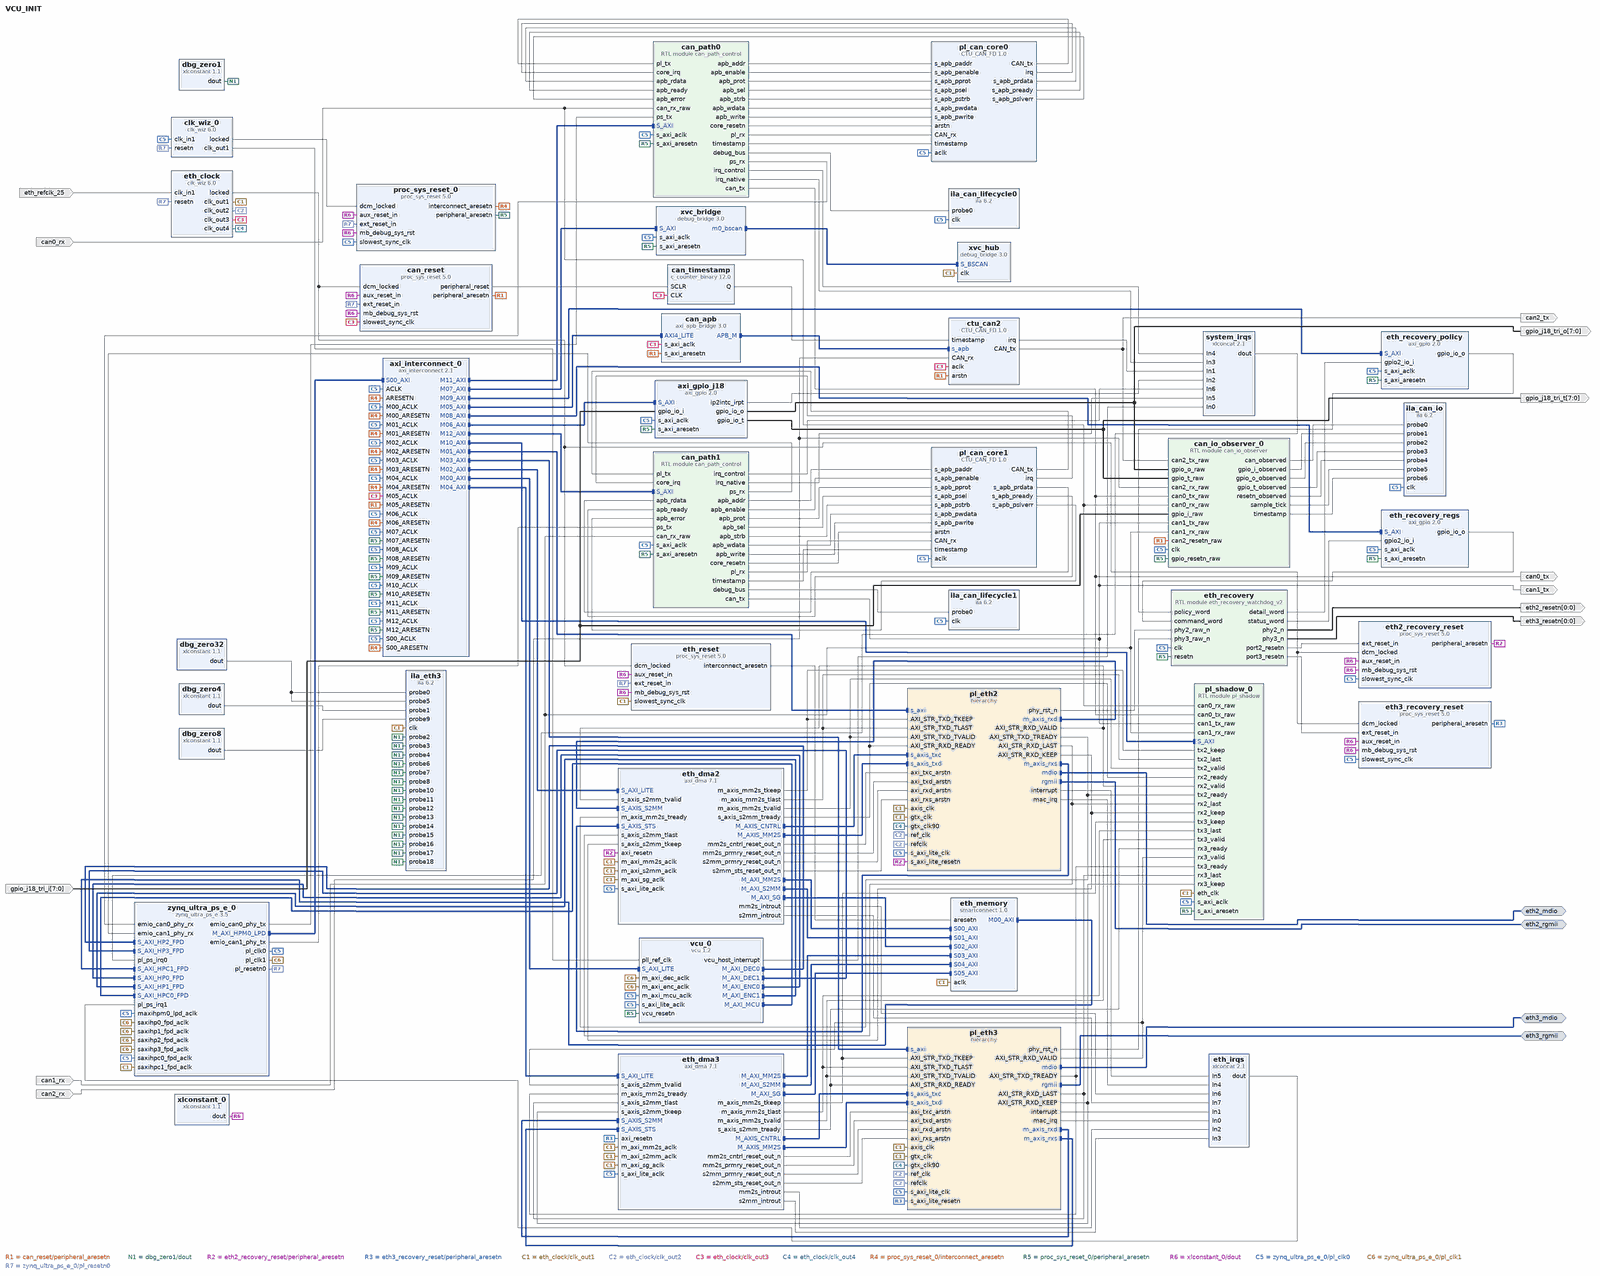
[diagram p0: block diagram of the top level, whole]
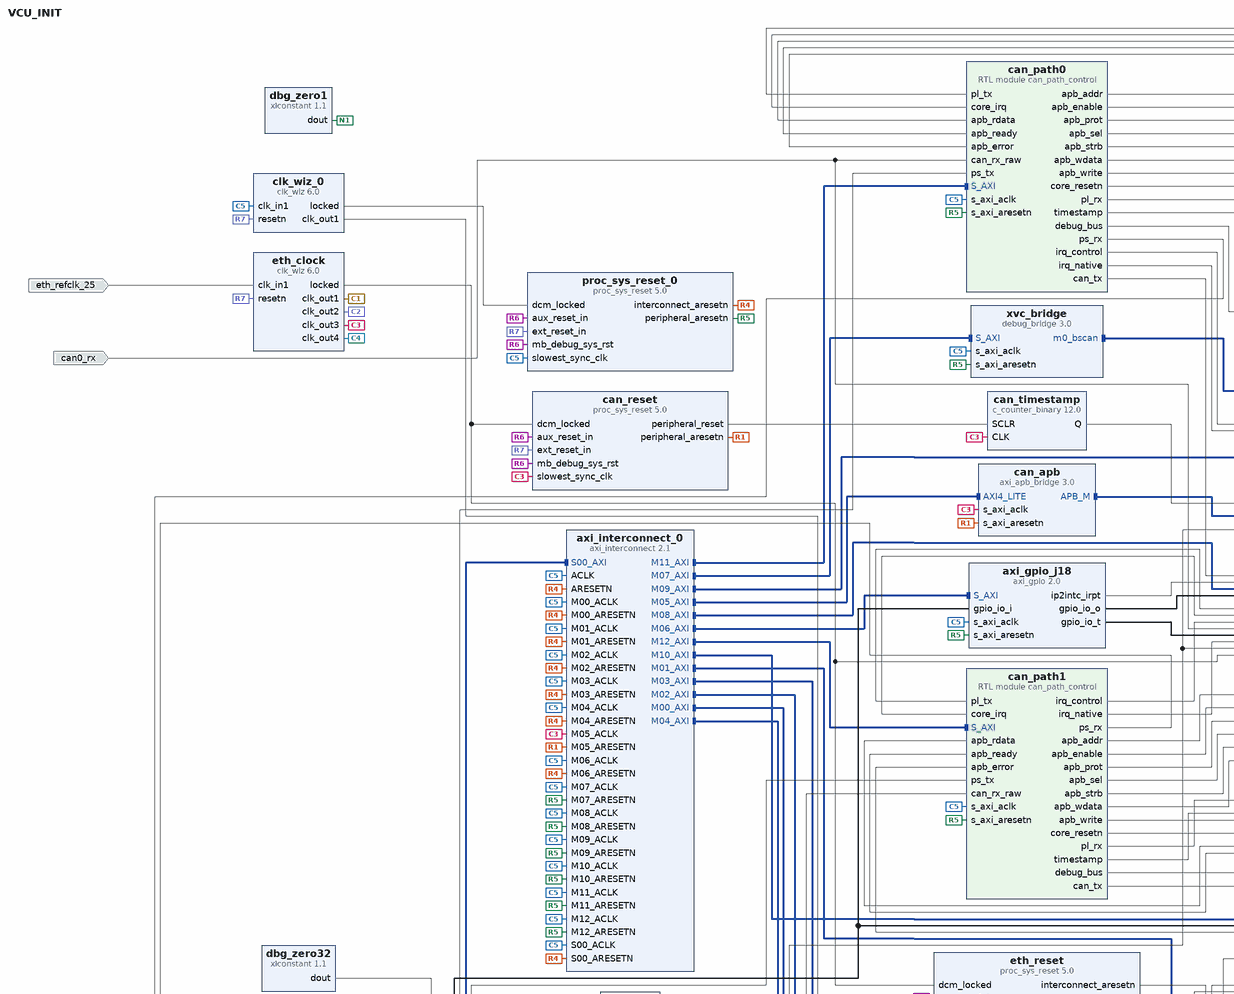
[diagram p1: block diagram of the top level, upper left part]
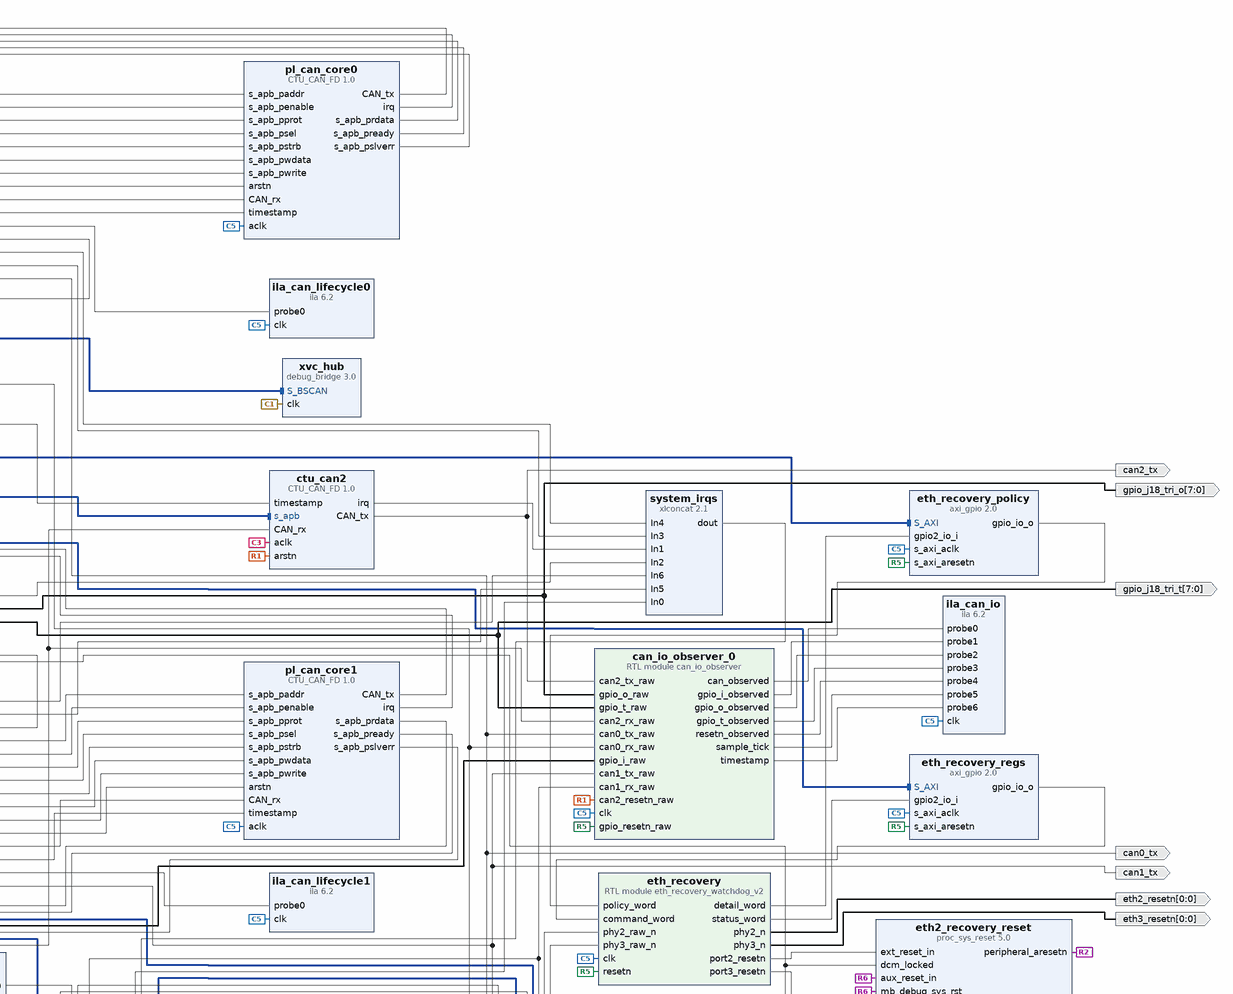
[diagram p2: block diagram of the top level, upper right part]
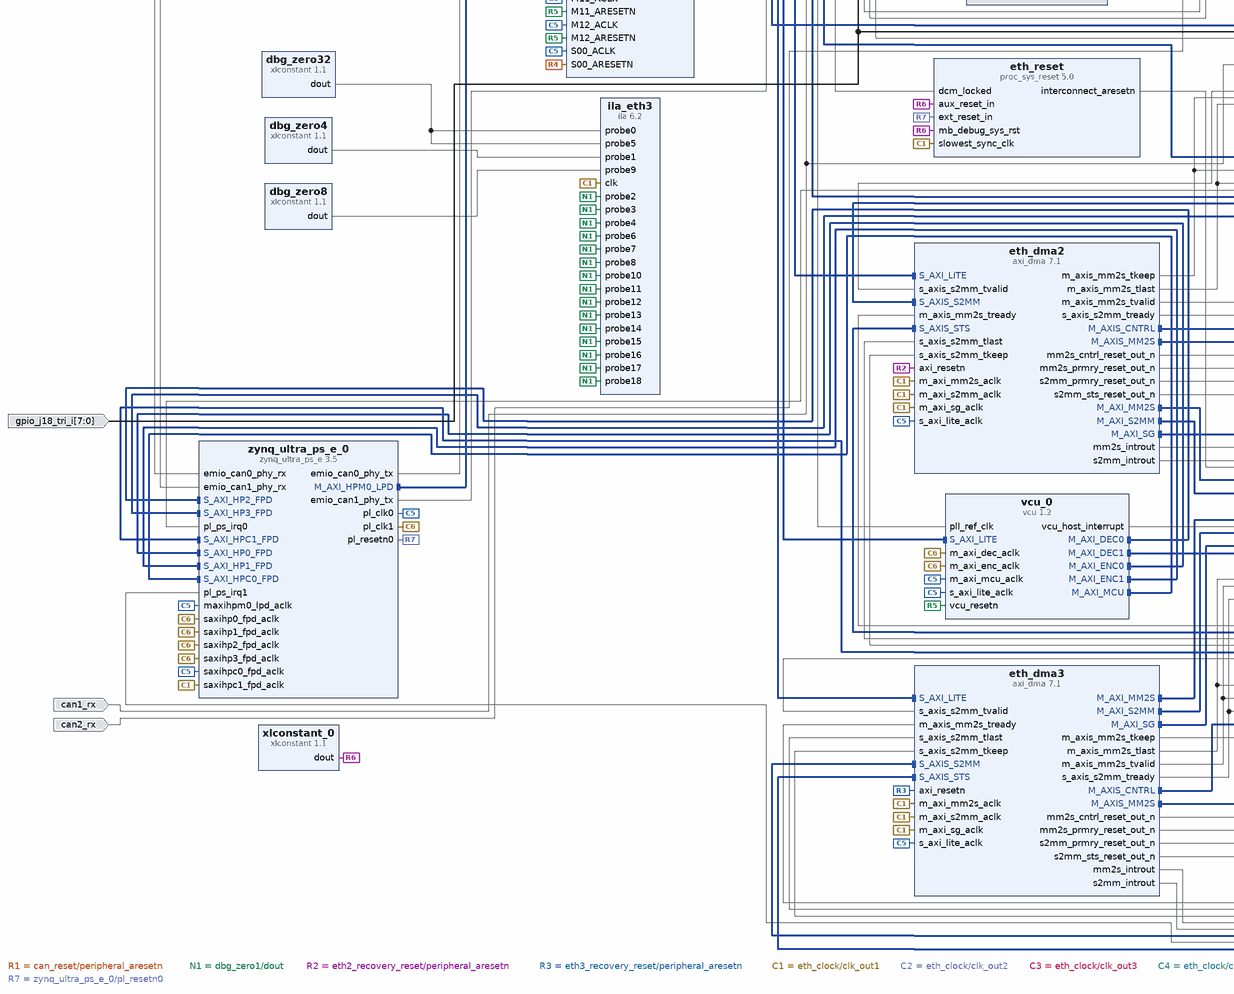
[diagram p3: block diagram of the top level, lower left part]
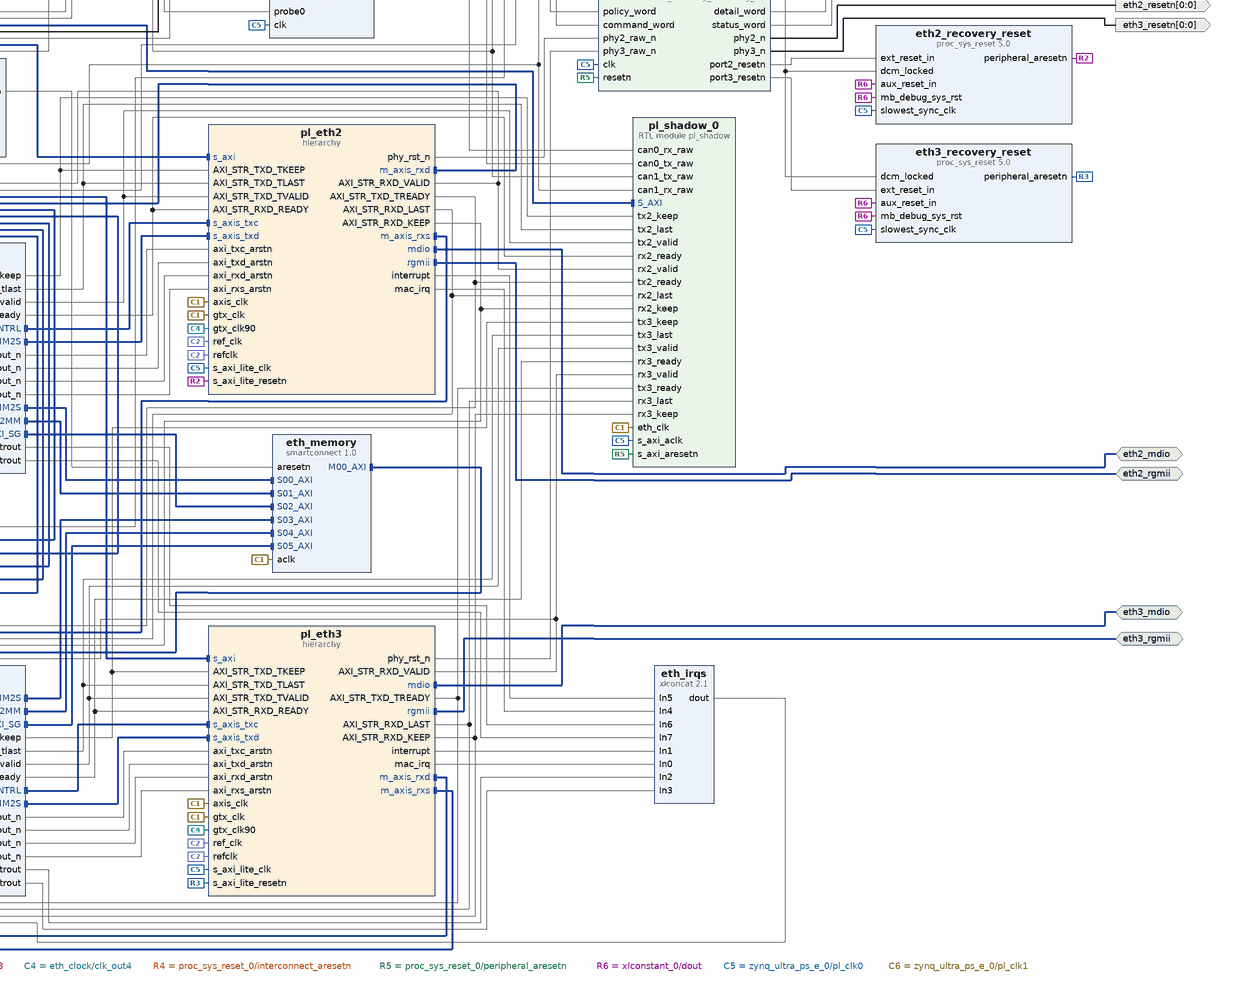
[diagram p4: block diagram of the top level, lower right part]
# Vivado block design VCU_INIT, xck26-sfvc784-2LV-c, Vivado 2026.1
create_bd_design VCU_INIT

create_bd_intf_port -mode Master -vlnv xilinx.com:interface:rgmii_rtl:1.0 eth2_rgmii
create_bd_intf_port -mode Master -vlnv xilinx.com:interface:mdio_rtl:1.0 eth2_mdio
create_bd_intf_port -mode Master -vlnv xilinx.com:interface:rgmii_rtl:1.0 eth3_rgmii
create_bd_intf_port -mode Master -vlnv xilinx.com:interface:mdio_rtl:1.0 eth3_mdio
create_bd_port -dir O -from 0 -to 0 -type rst eth2_resetn
create_bd_port -dir O -from 0 -to 0 -type rst eth3_resetn
create_bd_port -dir I -type clk eth_refclk_25
set_property -dict {CONFIG.FREQ_HZ 25000000} [get_bd_ports eth_refclk_25]
create_bd_port -dir I can0_rx
create_bd_port -dir O can0_tx
create_bd_port -dir I can1_rx
create_bd_port -dir O can1_tx
create_bd_port -dir I can2_rx
create_bd_port -dir O can2_tx
create_bd_port -dir I -from 7 -to 0 gpio_j18_tri_i
create_bd_port -dir O -from 7 -to 0 gpio_j18_tri_o
create_bd_port -dir O -from 7 -to 0 gpio_j18_tri_t

create_bd_cell -type ip -vlnv xilinx.com:ip:zynq_ultra_ps_e:3.5 zynq_ultra_ps_e_0
set_property -dict [list \
  CONFIG.PSU_BANK_0_IO_STANDARD LVCMOS18 \
  CONFIG.PSU_BANK_1_IO_STANDARD LVCMOS18 \
  CONFIG.PSU_BANK_2_IO_STANDARD LVCMOS18 \
  CONFIG.PSU_BANK_3_IO_STANDARD LVCMOS18 \
  CONFIG.PSU__CAN0__PERIPHERAL__ENABLE 1 \
  CONFIG.PSU__CAN0__PERIPHERAL__IO EMIO \
  CONFIG.PSU__CAN1__PERIPHERAL__ENABLE 1 \
  CONFIG.PSU__CAN1__PERIPHERAL__IO EMIO \
  CONFIG.PSU__CRF_APB__ACPU_CTRL__FREQMHZ 1333.333 \
  CONFIG.PSU__CRF_APB__ACPU_CTRL__SRCSEL APLL \
  CONFIG.PSU__CRF_APB__APLL_CTRL__SRCSEL PSS_REF_CLK \
  CONFIG.PSU__CRF_APB__APLL_FRAC_CFG__ENABLED 1 \
  CONFIG.PSU__CRF_APB__DBG_FPD_CTRL__FREQMHZ 250 \
  CONFIG.PSU__CRF_APB__DBG_FPD_CTRL__SRCSEL IOPLL \
  CONFIG.PSU__CRF_APB__DBG_TRACE_CTRL__FREQMHZ 250 \
  CONFIG.PSU__CRF_APB__DBG_TRACE_CTRL__SRCSEL IOPLL \
  CONFIG.PSU__CRF_APB__DBG_TSTMP_CTRL__FREQMHZ 250 \
  CONFIG.PSU__CRF_APB__DBG_TSTMP_CTRL__SRCSEL IOPLL \
  CONFIG.PSU__CRF_APB__DDR_CTRL__FREQMHZ 1200 \
  CONFIG.PSU__CRF_APB__DDR_CTRL__SRCSEL DPLL \
  CONFIG.PSU__CRF_APB__DPDMA_REF_CTRL__FREQMHZ 600 \
  CONFIG.PSU__CRF_APB__DPDMA_REF_CTRL__SRCSEL APLL \
  CONFIG.PSU__CRF_APB__DPLL_CTRL__SRCSEL PSS_REF_CLK \
  CONFIG.PSU__CRF_APB__DP_AUDIO_REF_CTRL__SRCSEL RPLL \
  CONFIG.PSU__CRF_APB__DP_STC_REF_CTRL__SRCSEL RPLL \
  CONFIG.PSU__CRF_APB__DP_VIDEO_REF_CTRL__SRCSEL VPLL \
  CONFIG.PSU__CRF_APB__GDMA_REF_CTRL__FREQMHZ 600 \
  CONFIG.PSU__CRF_APB__GDMA_REF_CTRL__SRCSEL DPLL \
  CONFIG.PSU__CRF_APB__GPU_REF_CTRL__FREQMHZ 600 \
  CONFIG.PSU__CRF_APB__GPU_REF_CTRL__SRCSEL IOPLL \
  CONFIG.PSU__CRF_APB__TOPSW_LSBUS_CTRL__FREQMHZ 100 \
  CONFIG.PSU__CRF_APB__TOPSW_LSBUS_CTRL__SRCSEL IOPLL \
  CONFIG.PSU__CRF_APB__TOPSW_MAIN_CTRL__FREQMHZ 533.33 \
  CONFIG.PSU__CRF_APB__TOPSW_MAIN_CTRL__SRCSEL DPLL \
  CONFIG.PSU__CRF_APB__VPLL_CTRL__SRCSEL PSS_REF_CLK \
  CONFIG.PSU__CRL_APB__ADMA_REF_CTRL__FREQMHZ 500 \
  CONFIG.PSU__CRL_APB__ADMA_REF_CTRL__SRCSEL IOPLL \
  CONFIG.PSU__CRL_APB__CAN1_REF_CTRL__FREQMHZ 100 \
  CONFIG.PSU__CRL_APB__CPU_R5_CTRL__FREQMHZ 533.333 \
  CONFIG.PSU__CRL_APB__CPU_R5_CTRL__SRCSEL RPLL \
  CONFIG.PSU__CRL_APB__DBG_LPD_CTRL__FREQMHZ 250 \
  CONFIG.PSU__CRL_APB__DBG_LPD_CTRL__SRCSEL IOPLL \
  CONFIG.PSU__CRL_APB__IOPLL_CTRL__SRCSEL PSS_REF_CLK \
  CONFIG.PSU__CRL_APB__IOU_SWITCH_CTRL__FREQMHZ 250 \
  CONFIG.PSU__CRL_APB__IOU_SWITCH_CTRL__SRCSEL IOPLL \
  CONFIG.PSU__CRL_APB__LPD_LSBUS_CTRL__FREQMHZ 100 \
  CONFIG.PSU__CRL_APB__LPD_LSBUS_CTRL__SRCSEL IOPLL \
  CONFIG.PSU__CRL_APB__LPD_SWITCH_CTRL__FREQMHZ 500 \
  CONFIG.PSU__CRL_APB__LPD_SWITCH_CTRL__SRCSEL IOPLL \
  CONFIG.PSU__CRL_APB__PCAP_CTRL__FREQMHZ 200 \
  CONFIG.PSU__CRL_APB__PCAP_CTRL__SRCSEL IOPLL \
  CONFIG.PSU__CRL_APB__PL0_REF_CTRL__FREQMHZ 100 \
  CONFIG.PSU__CRL_APB__PL0_REF_CTRL__SRCSEL IOPLL \
  CONFIG.PSU__CRL_APB__PL1_REF_CTRL__FREQMHZ 250 \
  CONFIG.PSU__CRL_APB__PL1_REF_CTRL__SRCSEL IOPLL \
  CONFIG.PSU__CRL_APB__QSPI_REF_CTRL__FREQMHZ 125 \
  CONFIG.PSU__CRL_APB__QSPI_REF_CTRL__SRCSEL IOPLL \
  CONFIG.PSU__CRL_APB__RPLL_CTRL__SRCSEL PSS_REF_CLK \
  CONFIG.PSU__CRL_APB__SPI1_REF_CTRL__SRCSEL IOPLL \
  CONFIG.PSU__CRL_APB__TIMESTAMP_REF_CTRL__FREQMHZ 100 \
  CONFIG.PSU__CRL_APB__TIMESTAMP_REF_CTRL__SRCSEL IOPLL \
  CONFIG.PSU__CSUPMU__PERIPHERAL__VALID 1 \
  CONFIG.PSU__DDRC__BUS_WIDTH {64 Bit} \
  CONFIG.PSU__DDRC__COMPONENTS Components \
  CONFIG.PSU__DDRC__DEVICE_CAPACITY {8192 MBits} \
  CONFIG.PSU__DDRC__DRAM_WIDTH {16 Bits} \
  CONFIG.PSU__DDRC__ECC Disabled \
  CONFIG.PSU__DDRC__MEMORY_TYPE {DDR 4} \
  CONFIG.PSU__DDRC__SPEED_BIN DDR4_2400R \
  CONFIG.PSU__DDR_HIGH_ADDRESS_GUI_ENABLE 1 \
  CONFIG.PSU__DDR__INTERFACE__FREQMHZ 600.000 \
  CONFIG.PSU__DISPLAYPORT__LANE0__ENABLE 1 \
  CONFIG.PSU__DISPLAYPORT__LANE0__IO {GT Lane1} \
  CONFIG.PSU__DISPLAYPORT__LANE1__ENABLE 0 \
  CONFIG.PSU__DISPLAYPORT__PERIPHERAL__ENABLE 1 \
  CONFIG.PSU__DPAUX__PERIPHERAL__ENABLE 1 \
  CONFIG.PSU__DPAUX__PERIPHERAL__IO {MIO 27 .. 30} \
  CONFIG.PSU__DP__LANE_SEL {Single Lower} \
  CONFIG.PSU__DP__REF_CLK_FREQ 27 \
  CONFIG.PSU__DP__REF_CLK_SEL {Ref Clk1} \
  CONFIG.PSU__FPGA_PL0_ENABLE 1 \
  CONFIG.PSU__FPGA_PL1_ENABLE 1 \
  CONFIG.PSU__GPIO0_MIO__IO {MIO 0 .. 25} \
  CONFIG.PSU__GPIO0_MIO__PERIPHERAL__ENABLE 1 \
  CONFIG.PSU__GPIO1_MIO__IO {MIO 26 .. 51} \
  CONFIG.PSU__GPIO1_MIO__PERIPHERAL__ENABLE 1 \
  CONFIG.PSU__GT__LINK_SPEED HBR \
  CONFIG.PSU__GT__PRE_EMPH_LVL_4 0 \
  CONFIG.PSU__GT__VLT_SWNG_LVL_4 0 \
  CONFIG.PSU__IOU_SLCR__IOU_TTC_APB_CLK__TTC0_SEL APB \
  CONFIG.PSU__IOU_SLCR__IOU_TTC_APB_CLK__TTC1_SEL APB \
  CONFIG.PSU__IOU_SLCR__IOU_TTC_APB_CLK__TTC2_SEL APB \
  CONFIG.PSU__IOU_SLCR__IOU_TTC_APB_CLK__TTC3_SEL APB \
  CONFIG.PSU__OVERRIDE__BASIC_CLOCK 0 \
  CONFIG.PSU__PMU_COHERENCY 0 \
  CONFIG.PSU__PMU__AIBACK__ENABLE 0 \
  CONFIG.PSU__PMU__EMIO_GPI__ENABLE 0 \
  CONFIG.PSU__PMU__EMIO_GPO__ENABLE 0 \
  CONFIG.PSU__PMU__GPI0__ENABLE 1 \
  CONFIG.PSU__PMU__GPI0__IO {MIO 26} \
  CONFIG.PSU__PMU__GPI1__ENABLE 0 \
  CONFIG.PSU__PMU__GPI2__ENABLE 0 \
  CONFIG.PSU__PMU__GPI3__ENABLE 0 \
  CONFIG.PSU__PMU__GPI4__ENABLE 0 \
  CONFIG.PSU__PMU__GPI5__ENABLE 1 \
  CONFIG.PSU__PMU__GPI5__IO {MIO 31} \
  CONFIG.PSU__PMU__GPO0__ENABLE 0 \
  CONFIG.PSU__PMU__GPO1__ENABLE 0 \
  CONFIG.PSU__PMU__GPO2__ENABLE 0 \
  CONFIG.PSU__PMU__GPO3__ENABLE 1 \
  CONFIG.PSU__PMU__GPO3__IO {MIO 35} \
  CONFIG.PSU__PMU__GPO3__POLARITY low \
  CONFIG.PSU__PMU__GPO4__ENABLE 0 \
  CONFIG.PSU__PMU__GPO5__ENABLE 0 \
  CONFIG.PSU__PMU__PERIPHERAL__ENABLE 1 \
  CONFIG.PSU__PMU__PLERROR__ENABLE 0 \
  CONFIG.PSU__PRESET_APPLIED 1 \
  CONFIG.PSU__PSS_REF_CLK__FREQMHZ 33.333 \
  CONFIG.PSU__QSPI_COHERENCY 0 \
  CONFIG.PSU__QSPI_ROUTE_THROUGH_FPD 0 \
  CONFIG.PSU__QSPI__GRP_FBCLK__ENABLE 0 \
  CONFIG.PSU__QSPI__PERIPHERAL__DATA_MODE x4 \
  CONFIG.PSU__QSPI__PERIPHERAL__ENABLE 1 \
  CONFIG.PSU__QSPI__PERIPHERAL__IO {MIO 0 .. 5} \
  CONFIG.PSU__QSPI__PERIPHERAL__MODE Single \
  CONFIG.PSU__SAXIGP0__DATA_WIDTH 32 \
  CONFIG.PSU__SPI1__GRP_SS0__IO {MIO 9} \
  CONFIG.PSU__SPI1__PERIPHERAL__ENABLE 1 \
  CONFIG.PSU__SPI1__PERIPHERAL__IO {MIO 6 .. 11} \
  CONFIG.PSU__SWDT0__CLOCK__ENABLE 0 \
  CONFIG.PSU__SWDT0__PERIPHERAL__ENABLE 1 \
  CONFIG.PSU__SWDT0__RESET__ENABLE 0 \
  CONFIG.PSU__SWDT1__CLOCK__ENABLE 0 \
  CONFIG.PSU__SWDT1__PERIPHERAL__ENABLE 1 \
  CONFIG.PSU__SWDT1__RESET__ENABLE 0 \
  CONFIG.PSU__TTC0__CLOCK__ENABLE 0 \
  CONFIG.PSU__TTC0__PERIPHERAL__ENABLE 1 \
  CONFIG.PSU__TTC0__WAVEOUT__ENABLE 0 \
  CONFIG.PSU__TTC1__CLOCK__ENABLE 0 \
  CONFIG.PSU__TTC1__PERIPHERAL__ENABLE 1 \
  CONFIG.PSU__TTC1__WAVEOUT__ENABLE 0 \
  CONFIG.PSU__TTC2__CLOCK__ENABLE 0 \
  CONFIG.PSU__TTC2__PERIPHERAL__ENABLE 1 \
  CONFIG.PSU__TTC2__WAVEOUT__ENABLE 0 \
  CONFIG.PSU__TTC3__CLOCK__ENABLE 0 \
  CONFIG.PSU__TTC3__PERIPHERAL__ENABLE 1 \
  CONFIG.PSU__TTC3__WAVEOUT__ENABLE 0 \
  CONFIG.PSU__USE__IRQ0 1 \
  CONFIG.PSU__USE__IRQ1 1 \
  CONFIG.PSU__USE__M_AXI_GP0 0 \
  CONFIG.PSU__USE__M_AXI_GP1 0 \
  CONFIG.PSU__USE__M_AXI_GP2 1 \
  CONFIG.PSU__USE__S_AXI_GP0 1 \
  CONFIG.PSU__USE__S_AXI_GP1 1 \
  CONFIG.PSU__USE__S_AXI_GP2 1 \
  CONFIG.PSU__USE__S_AXI_GP3 1 \
  CONFIG.PSU__USE__S_AXI_GP4 1 \
  CONFIG.PSU__USE__S_AXI_GP5 1 \
] [get_bd_cells zynq_ultra_ps_e_0]
# 268 more settings of zynq_ultra_ps_e_0 are not shown: defaults, MIO pin electricals, DDR timing, and values the tool derives
create_bd_cell -type ip -vlnv xilinx.com:ip:vcu:1.2 vcu_0
set_property -dict [list \
  CONFIG.DEC_CODING_TYPE 1 \
  CONFIG.DEC_COLOR_DEPTH 0 \
  CONFIG.DEC_COLOR_FORMAT 0 \
  CONFIG.DEC_FPS 1 \
  CONFIG.DEC_FRAME_SIZE 3 \
  CONFIG.DEC_VIDEO_STANDARD 1 \
  CONFIG.ENC_CODING_TYPE 1 \
  CONFIG.ENC_COLOR_DEPTH 0 \
  CONFIG.ENC_COLOR_FORMAT 0 \
  CONFIG.ENC_FPS 1 \
  CONFIG.ENC_FRAME_SIZE 3 \
  CONFIG.ENC_VIDEO_STANDARD 1 \
] [get_bd_cells vcu_0]
create_bd_cell -type ip -vlnv xilinx.com:ip:axi_interconnect:2.1 axi_interconnect_0
set_property -dict {CONFIG.NUM_MI 13} [get_bd_cells axi_interconnect_0]
create_bd_cell -type ip -vlnv xilinx.com:ip:proc_sys_reset:5.0 proc_sys_reset_0
set_property -dict {CONFIG.C_AUX_RESET_HIGH 1} [get_bd_cells proc_sys_reset_0]
create_bd_cell -type ip -vlnv xilinx.com:ip:clk_wiz:6.0 clk_wiz_0
set_property -dict [list \
  CONFIG.CLKOUT1_JITTER 212.271 \
  CONFIG.CLKOUT1_PHASE_ERROR 333.667 \
  CONFIG.CLKOUT1_REQUESTED_OUT_FREQ 59.000 \
  CONFIG.MMCM_CLKFBOUT_MULT_F 87.250 \
  CONFIG.MMCM_CLKOUT0_DIVIDE_F 21.125 \
  CONFIG.MMCM_DIVCLK_DIVIDE 7 \
  CONFIG.PRIM_SOURCE No_buffer \
  CONFIG.RESET_PORT resetn \
  CONFIG.RESET_TYPE ACTIVE_LOW \
] [get_bd_cells clk_wiz_0]
create_bd_cell -type ip -vlnv xilinx.com:ip:xlconstant:1.1 xlconstant_0
set_property -dict {CONFIG.CONST_VAL 0} [get_bd_cells xlconstant_0]
create_bd_cell -type ip -vlnv xilinx.com:ip:axi_dma:7.1 eth_dma2
set_property -dict [list \
  CONFIG.c_addr_width 32 \
  CONFIG.c_include_mm2s_dre 1 \
  CONFIG.c_include_s2mm_dre 1 \
  CONFIG.c_include_sg 1 \
  CONFIG.c_m_axi_mm2s_data_width 64 \
  CONFIG.c_m_axi_s2mm_data_width 64 \
  CONFIG.c_m_axis_mm2s_tdata_width 32 \
  CONFIG.c_s_axis_s2mm_tdata_width 32 \
  CONFIG.c_sg_include_stscntrl_strm 1 \
  CONFIG.c_sg_length_width 16 \
] [get_bd_cells eth_dma2]
create_bd_cell -type ip -vlnv xilinx.com:ip:axi_dma:7.1 eth_dma3
set_property -dict [list \
  CONFIG.c_addr_width 32 \
  CONFIG.c_include_mm2s_dre 1 \
  CONFIG.c_include_s2mm_dre 1 \
  CONFIG.c_include_sg 1 \
  CONFIG.c_m_axi_mm2s_data_width 64 \
  CONFIG.c_m_axi_s2mm_data_width 64 \
  CONFIG.c_m_axis_mm2s_tdata_width 32 \
  CONFIG.c_s_axis_s2mm_tdata_width 32 \
  CONFIG.c_sg_include_stscntrl_strm 1 \
  CONFIG.c_sg_length_width 16 \
] [get_bd_cells eth_dma3]
create_bd_cell -type ip -vlnv xilinx.com:ip:clk_wiz:6.0 eth_clock
set_property -dict [list \
  CONFIG.CLKOUT1_REQUESTED_OUT_FREQ 125.000 \
  CONFIG.CLKOUT2_REQUESTED_OUT_FREQ 333.333 \
  CONFIG.CLKOUT2_USED true \
  CONFIG.CLKOUT3_REQUESTED_OUT_FREQ 50.000 \
  CONFIG.CLKOUT3_USED true \
  CONFIG.CLKOUT4_REQUESTED_OUT_FREQ 125.000 \
  CONFIG.CLKOUT4_REQUESTED_PHASE 90.000 \
  CONFIG.CLKOUT4_USED true \
  CONFIG.NUM_OUT_CLKS 4 \
  CONFIG.PRIM_IN_FREQ 25.000 \
  CONFIG.RESET_TYPE ACTIVE_LOW \
  CONFIG.USE_RESET true \
] [get_bd_cells eth_clock]
create_bd_cell -type ip -vlnv xilinx.com:ip:proc_sys_reset:5.0 eth_reset
set_property -dict {CONFIG.C_AUX_RESET_HIGH 1 CONFIG.C_EXT_RESET_HIGH 0} [get_bd_cells eth_reset]
create_bd_cell -type ip -vlnv xilinx.com:ip:smartconnect:1.0 eth_memory
set_property -dict {CONFIG.NUM_MI 1 CONFIG.NUM_SI 6} [get_bd_cells eth_memory]
create_bd_cell -type ip -vlnv xilinx.com:ip:xlconcat:2.1 eth_irqs
set_property -dict {CONFIG.NUM_PORTS 8} [get_bd_cells eth_irqs]
create_bd_cell -type ip -vlnv xilinx.com:ip:xlconcat:2.1 system_irqs
set_property -dict {CONFIG.NUM_PORTS 7} [get_bd_cells system_irqs]
create_bd_cell -type ip -vlnv xilinx.com:ip:proc_sys_reset:5.0 can_reset
set_property -dict {CONFIG.C_AUX_RESET_HIGH 1 CONFIG.C_EXT_RESET_HIGH 0} [get_bd_cells can_reset]
create_bd_cell -type ip -vlnv user.org:user:CTU_CAN_FD:1.0 ctu_can2
set_property -dict [list \
  CONFIG.rx_buffer_size 512 \
  CONFIG.sup_filtA true \
  CONFIG.sup_filtB true \
  CONFIG.sup_filtC true \
  CONFIG.sup_range true \
  CONFIG.sup_traffic_ctrs true \
] [get_bd_cells ctu_can2]
create_bd_cell -type ip -vlnv xilinx.com:ip:axi_apb_bridge:3.0 can_apb
set_property -dict {CONFIG.C_APB_NUM_SLAVES 1 CONFIG.C_M_APB_PROTOCOL apb4} [get_bd_cells can_apb]
create_bd_cell -type ip -vlnv xilinx.com:ip:c_counter_binary:12.0 can_timestamp
set_property -dict {CONFIG.CE false CONFIG.Output_Width 64 CONFIG.SCLR true} [get_bd_cells can_timestamp]
create_bd_cell -type ip -vlnv xilinx.com:ip:axi_gpio:2.0 axi_gpio_j18
set_property -dict [list \
  CONFIG.C_ALL_INPUTS 0 \
  CONFIG.C_ALL_OUTPUTS 0 \
  CONFIG.C_DOUT_DEFAULT 0x00000000 \
  CONFIG.C_GPIO_WIDTH 8 \
  CONFIG.C_INTERRUPT_PRESENT 1 \
  CONFIG.C_IS_DUAL 0 \
  CONFIG.C_TRI_DEFAULT 0xFFFFFFFF \
] [get_bd_cells axi_gpio_j18]
create_bd_cell -type ip -vlnv xilinx.com:ip:debug_bridge:3.0 xvc_bridge
set_property -dict {CONFIG.C_DEBUG_MODE 2 CONFIG.C_NUM_BS_MASTER 1 CONFIG.C_USE_EXT_BSCAN false} [get_bd_cells xvc_bridge]
create_bd_cell -type ip -vlnv xilinx.com:ip:debug_bridge:3.0 xvc_hub
set_property -dict [list \
  CONFIG.C_CLK_INPUT_FREQ_HZ 125000000 \
  CONFIG.C_DEBUG_MODE 1 \
  CONFIG.C_ENABLE_CLK_DIVIDER false \
  CONFIG.C_USE_EXT_BSCAN true \
] [get_bd_cells xvc_hub]
create_bd_cell -type ip -vlnv xilinx.com:ip:ila:6.2 ila_eth3
set_property -dict [list \
  CONFIG.C_DATA_DEPTH 8192 \
  CONFIG.C_INPUT_PIPE_STAGES 2 \
  CONFIG.C_MONITOR_TYPE Native \
  CONFIG.C_NUM_OF_PROBES 19 \
  CONFIG.C_PROBE0_WIDTH 32 \
  CONFIG.C_PROBE10_WIDTH 1 \
  CONFIG.C_PROBE11_WIDTH 1 \
  CONFIG.C_PROBE12_WIDTH 1 \
  CONFIG.C_PROBE13_WIDTH 1 \
  CONFIG.C_PROBE14_WIDTH 1 \
  CONFIG.C_PROBE15_WIDTH 1 \
  CONFIG.C_PROBE16_WIDTH 1 \
  CONFIG.C_PROBE17_WIDTH 1 \
  CONFIG.C_PROBE18_WIDTH 1 \
  CONFIG.C_PROBE1_WIDTH 4 \
  CONFIG.C_PROBE2_WIDTH 1 \
  CONFIG.C_PROBE3_WIDTH 1 \
  CONFIG.C_PROBE4_WIDTH 1 \
  CONFIG.C_PROBE5_WIDTH 32 \
  CONFIG.C_PROBE6_WIDTH 1 \
  CONFIG.C_PROBE7_WIDTH 1 \
  CONFIG.C_PROBE8_WIDTH 1 \
  CONFIG.C_PROBE9_WIDTH 8 \
] [get_bd_cells ila_eth3]
create_bd_cell -type ip -vlnv xilinx.com:ip:xlconstant:1.1 dbg_zero8
set_property -dict {CONFIG.CONST_VAL 0 CONFIG.CONST_WIDTH 8} [get_bd_cells dbg_zero8]
create_bd_cell -type ip -vlnv xilinx.com:ip:xlconstant:1.1 dbg_zero1
set_property -dict {CONFIG.CONST_VAL 0 CONFIG.CONST_WIDTH 1} [get_bd_cells dbg_zero1]
create_bd_cell -type ip -vlnv xilinx.com:ip:xlconstant:1.1 dbg_zero32
set_property -dict {CONFIG.CONST_VAL 0 CONFIG.CONST_WIDTH 32} [get_bd_cells dbg_zero32]
create_bd_cell -type ip -vlnv xilinx.com:ip:xlconstant:1.1 dbg_zero4
set_property -dict {CONFIG.CONST_VAL 0 CONFIG.CONST_WIDTH 4} [get_bd_cells dbg_zero4]
create_bd_cell -type ip -vlnv xilinx.com:ip:axi_gpio:2.0 eth_recovery_regs
set_property -dict [list \
  CONFIG.C_ALL_INPUTS 0 \
  CONFIG.C_ALL_INPUTS_2 1 \
  CONFIG.C_ALL_OUTPUTS 1 \
  CONFIG.C_DOUT_DEFAULT 0x00000000 \
  CONFIG.C_GPIO2_WIDTH 32 \
  CONFIG.C_GPIO_WIDTH 32 \
  CONFIG.C_INTERRUPT_PRESENT 0 \
  CONFIG.C_IS_DUAL 1 \
] [get_bd_cells eth_recovery_regs]
create_bd_cell -type ip -vlnv xilinx.com:ip:proc_sys_reset:5.0 eth2_recovery_reset
set_property -dict {CONFIG.C_AUX_RESET_HIGH 1 CONFIG.C_EXT_RESET_HIGH 0} [get_bd_cells eth2_recovery_reset]
create_bd_cell -type ip -vlnv xilinx.com:ip:proc_sys_reset:5.0 eth3_recovery_reset
set_property -dict {CONFIG.C_AUX_RESET_HIGH 1 CONFIG.C_EXT_RESET_HIGH 0} [get_bd_cells eth3_recovery_reset]
create_bd_cell -type ip -vlnv xilinx.com:ip:axi_gpio:2.0 eth_recovery_policy
set_property -dict [list \
  CONFIG.C_ALL_INPUTS 0 \
  CONFIG.C_ALL_INPUTS_2 1 \
  CONFIG.C_ALL_OUTPUTS 1 \
  CONFIG.C_DOUT_DEFAULT 0x00000000 \
  CONFIG.C_GPIO2_WIDTH 32 \
  CONFIG.C_GPIO_WIDTH 32 \
  CONFIG.C_INTERRUPT_PRESENT 0 \
  CONFIG.C_IS_DUAL 1 \
] [get_bd_cells eth_recovery_policy]
create_bd_cell -type module -reference eth_recovery_watchdog_v2 eth_recovery
create_bd_cell -type hier pl_eth2
create_bd_cell -type hier pl_eth3
create_bd_cell -type module -reference can_io_observer can_io_observer_0
create_bd_cell -type ip -vlnv xilinx.com:ip:ila:6.2 ila_can_io
set_property -dict [list \
  CONFIG.ALL_PROBE_SAME_MU true \
  CONFIG.ALL_PROBE_SAME_MU_CNT 2 \
  CONFIG.C_DATA_DEPTH 8192 \
  CONFIG.C_EN_STRG_QUAL 1 \
  CONFIG.C_INPUT_PIPE_STAGES 2 \
  CONFIG.C_MONITOR_TYPE Native \
  CONFIG.C_NUM_OF_PROBES 7 \
  CONFIG.C_PROBE0_WIDTH 6 \
  CONFIG.C_PROBE1_WIDTH 8 \
  CONFIG.C_PROBE2_WIDTH 8 \
  CONFIG.C_PROBE3_WIDTH 8 \
  CONFIG.C_PROBE4_WIDTH 2 \
  CONFIG.C_PROBE5_WIDTH 1 \
  CONFIG.C_PROBE6_WIDTH 32 \
] [get_bd_cells ila_can_io]
create_bd_cell -type module -reference pl_shadow pl_shadow_0
create_bd_cell -type ip -vlnv user.org:user:CTU_CAN_FD:1.0 pl_can_core0
set_property -dict [list \
  CONFIG.rx_buffer_size 512 \
  CONFIG.sup_filtA true \
  CONFIG.sup_filtB true \
  CONFIG.sup_filtC true \
  CONFIG.sup_range true \
  CONFIG.sup_traffic_ctrs true \
] [get_bd_cells pl_can_core0]
create_bd_cell -type module -reference can_path_control can_path0
set_property -dict {CONFIG.CHANNEL 0} [get_bd_cells can_path0]
create_bd_cell -type ip -vlnv user.org:user:CTU_CAN_FD:1.0 pl_can_core1
set_property -dict [list \
  CONFIG.rx_buffer_size 512 \
  CONFIG.sup_filtA true \
  CONFIG.sup_filtB true \
  CONFIG.sup_filtC true \
  CONFIG.sup_range true \
  CONFIG.sup_traffic_ctrs true \
] [get_bd_cells pl_can_core1]
create_bd_cell -type module -reference can_path_control can_path1
set_property -dict {CONFIG.CHANNEL 1} [get_bd_cells can_path1]
create_bd_cell -type ip -vlnv xilinx.com:ip:ila:6.2 ila_can_lifecycle0
set_property -dict [list \
  CONFIG.C_DATA_DEPTH 1024 \
  CONFIG.C_MONITOR_TYPE Native \
  CONFIG.C_NUM_OF_PROBES 1 \
  CONFIG.C_PROBE0_WIDTH 512 \
] [get_bd_cells ila_can_lifecycle0]
create_bd_cell -type ip -vlnv xilinx.com:ip:ila:6.2 ila_can_lifecycle1
set_property -dict [list \
  CONFIG.C_DATA_DEPTH 1024 \
  CONFIG.C_MONITOR_TYPE Native \
  CONFIG.C_NUM_OF_PROBES 1 \
  CONFIG.C_PROBE0_WIDTH 512 \
] [get_bd_cells ila_can_lifecycle1]

# ---- hierarchy /pl_eth2 ----
current_bd_instance /pl_eth2
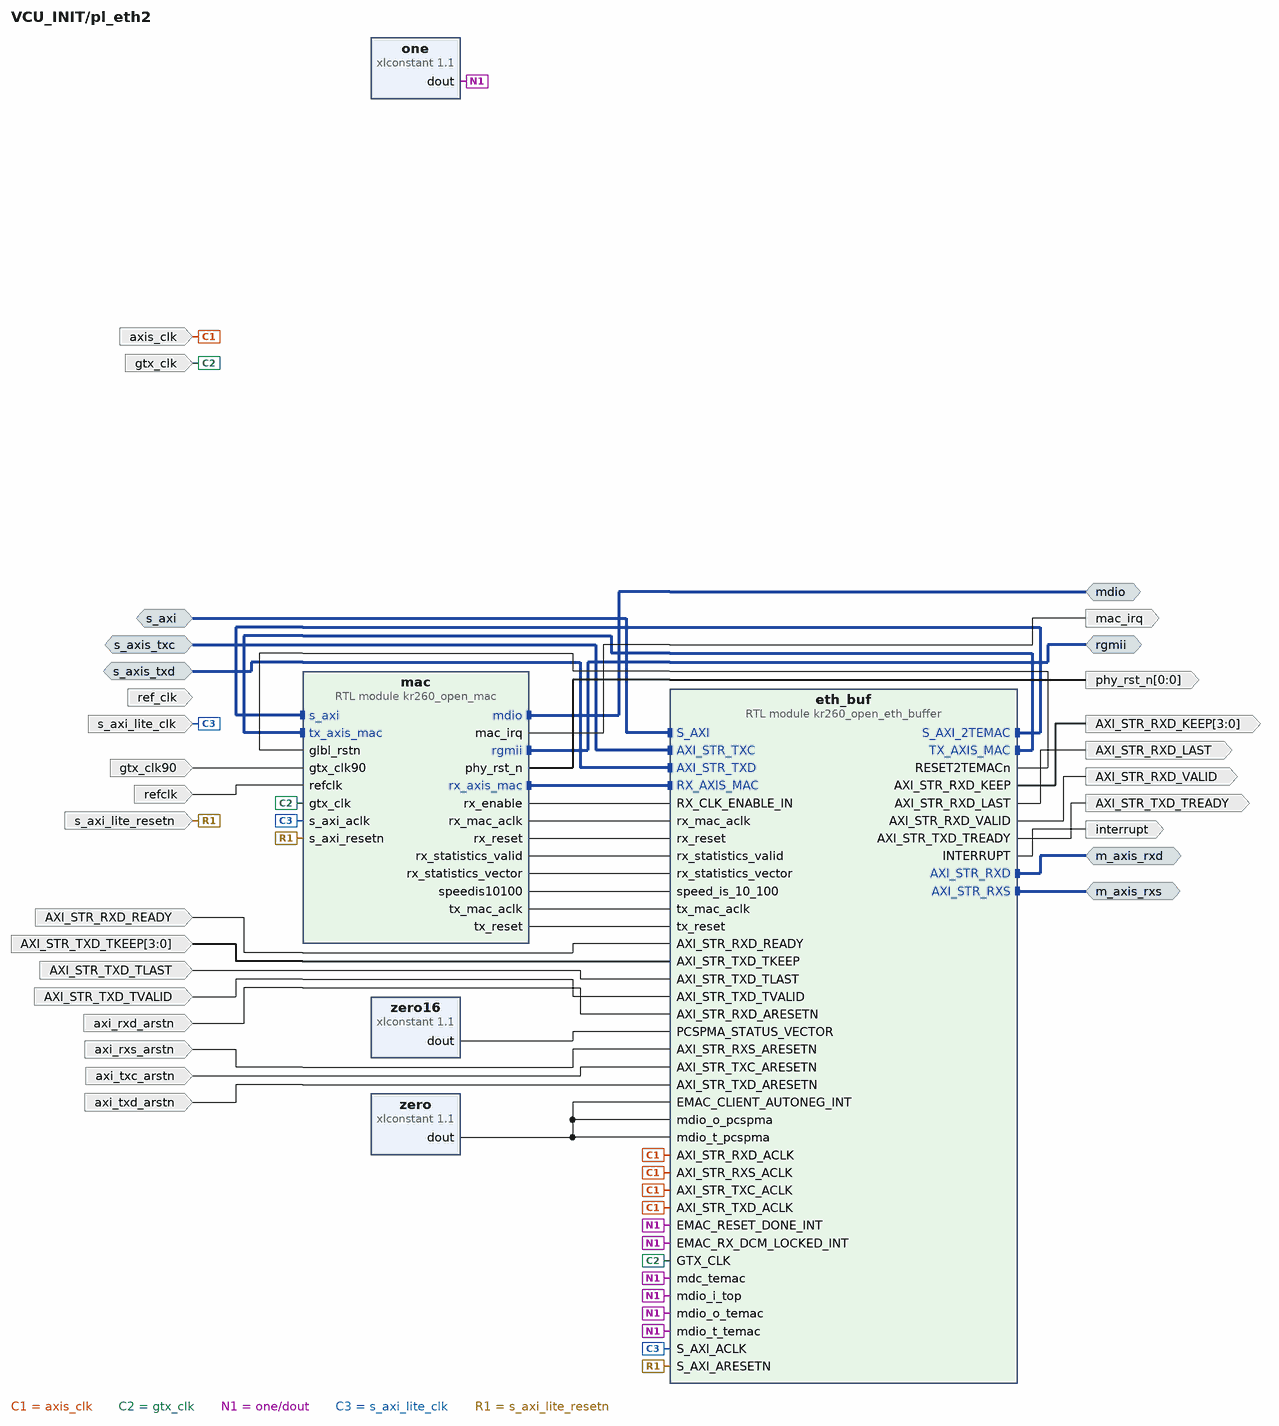
[diagram p5: block diagram inside /pl_eth2]
create_bd_intf_pin -mode Master -vlnv xilinx.com:interface:axis_rtl:1.0 m_axis_rxd
create_bd_intf_pin -mode Master -vlnv xilinx.com:interface:axis_rtl:1.0 m_axis_rxs
create_bd_intf_pin -mode Master -vlnv xilinx.com:interface:mdio_rtl:1.0 mdio
create_bd_intf_pin -mode Master -vlnv xilinx.com:interface:rgmii_rtl:1.0 rgmii
create_bd_intf_pin -mode Slave -vlnv xilinx.com:interface:aximm_rtl:1.0 s_axi
create_bd_intf_pin -mode Slave -vlnv xilinx.com:interface:axis_rtl:1.0 s_axis_txc
create_bd_intf_pin -mode Slave -vlnv xilinx.com:interface:axis_rtl:1.0 s_axis_txd
create_bd_pin -dir I -type rst axi_rxd_arstn
create_bd_pin -dir I -type rst axi_rxs_arstn
create_bd_pin -dir I -type rst axi_txc_arstn
create_bd_pin -dir I -type rst axi_txd_arstn
create_bd_pin -dir I -type clk axis_clk
create_bd_pin -dir I -type clk gtx_clk
create_bd_pin -dir O -type intr interrupt
create_bd_pin -dir O -type intr mac_irq
create_bd_pin -dir O -from 0 -to 0 -type rst phy_rst_n
create_bd_pin -dir I -type clk ref_clk
create_bd_pin -dir I -type clk s_axi_lite_clk
create_bd_pin -dir I -type rst s_axi_lite_resetn
create_bd_pin -dir I -type clk gtx_clk90
create_bd_pin -dir I -type clk refclk
create_bd_pin -dir I AXI_STR_TXD_TVALID
create_bd_pin -dir O AXI_STR_RXD_VALID
create_bd_pin -dir O AXI_STR_TXD_TREADY
create_bd_pin -dir I AXI_STR_RXD_READY
create_bd_pin -dir I AXI_STR_TXD_TLAST
create_bd_pin -dir O AXI_STR_RXD_LAST
create_bd_pin -dir I -from 3 -to 0 AXI_STR_TXD_TKEEP
create_bd_pin -dir O -from 3 -to 0 AXI_STR_RXD_KEEP

create_bd_cell -type module -reference kr260_open_mac mac
create_bd_cell -type ip -vlnv xilinx.com:ip:xlconstant:1.1 one
create_bd_cell -type ip -vlnv xilinx.com:ip:xlconstant:1.1 zero
set_property -dict {CONFIG.CONST_VAL 0} [get_bd_cells zero]
create_bd_cell -type module -reference kr260_open_eth_buffer eth_buf
create_bd_cell -type ip -vlnv xilinx.com:ip:xlconstant:1.1 zero16
set_property -dict {CONFIG.CONST_VAL 0 CONFIG.CONST_WIDTH 16} [get_bd_cells zero16]

# ---- hierarchy /pl_eth3 ----
current_bd_instance /pl_eth3
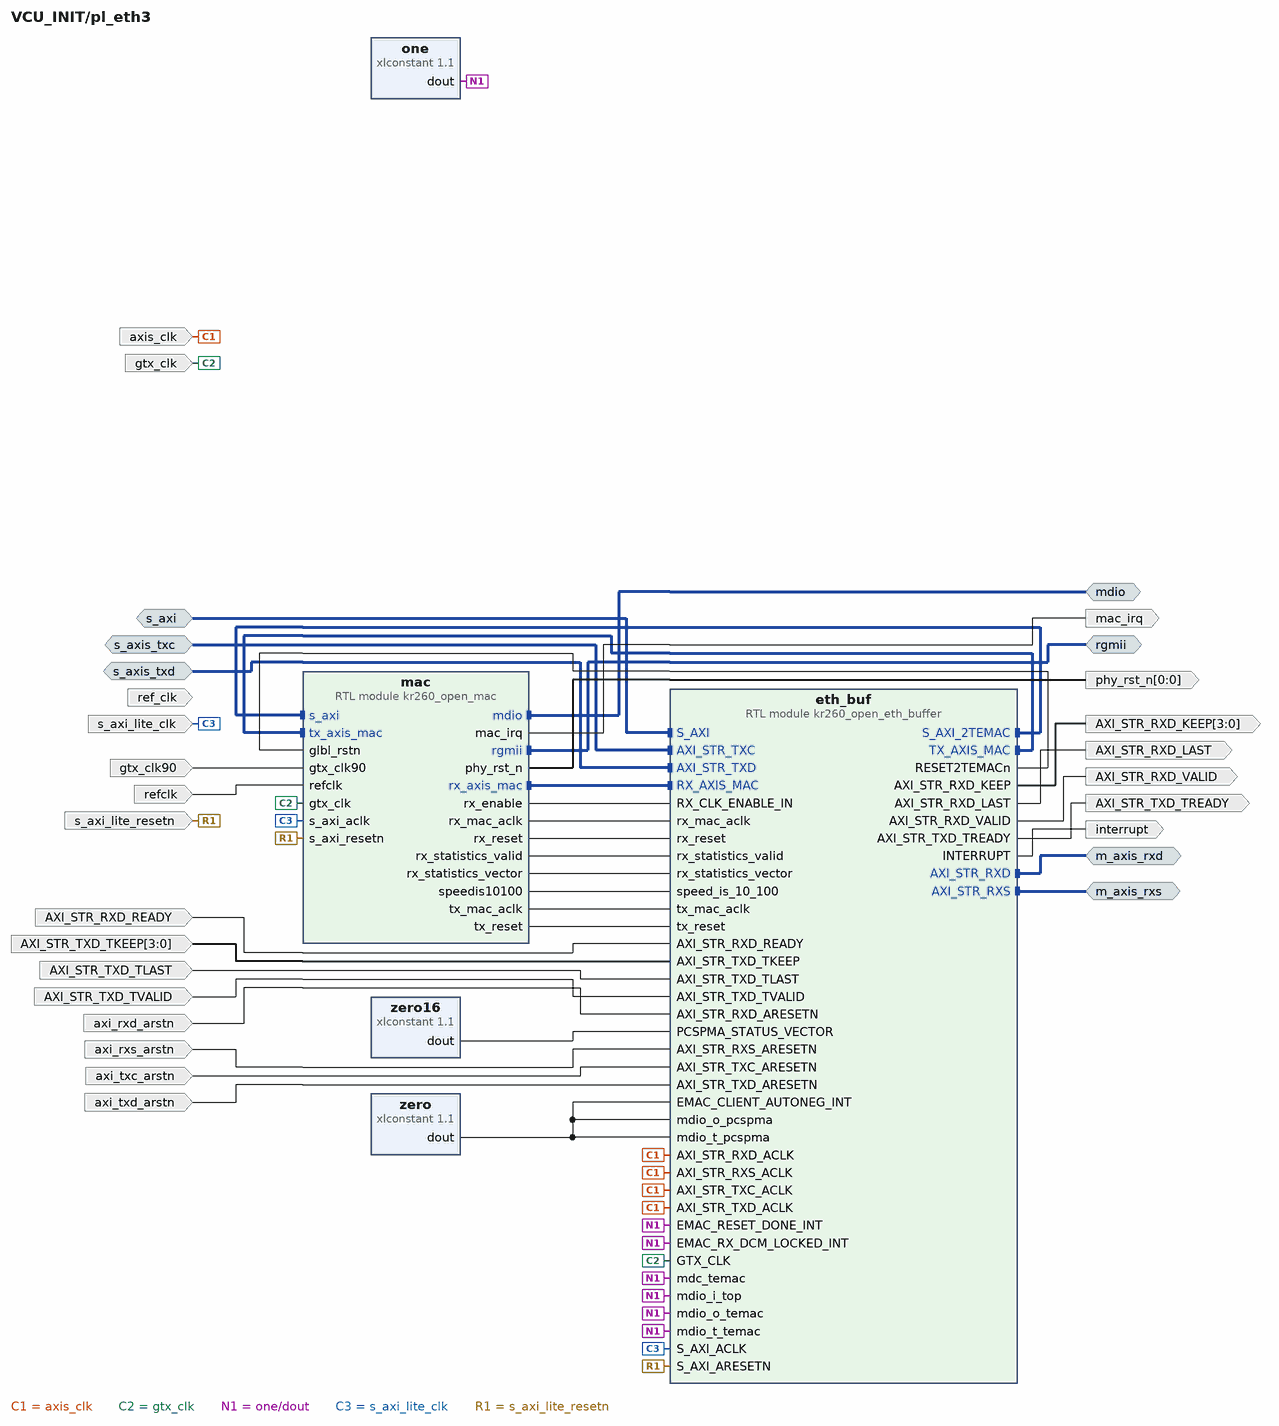
[diagram p6: block diagram inside /pl_eth3]
create_bd_intf_pin -mode Master -vlnv xilinx.com:interface:axis_rtl:1.0 m_axis_rxd
create_bd_intf_pin -mode Master -vlnv xilinx.com:interface:axis_rtl:1.0 m_axis_rxs
create_bd_intf_pin -mode Master -vlnv xilinx.com:interface:mdio_rtl:1.0 mdio
create_bd_intf_pin -mode Master -vlnv xilinx.com:interface:rgmii_rtl:1.0 rgmii
create_bd_intf_pin -mode Slave -vlnv xilinx.com:interface:aximm_rtl:1.0 s_axi
create_bd_intf_pin -mode Slave -vlnv xilinx.com:interface:axis_rtl:1.0 s_axis_txc
create_bd_intf_pin -mode Slave -vlnv xilinx.com:interface:axis_rtl:1.0 s_axis_txd
create_bd_pin -dir I -type rst axi_rxd_arstn
create_bd_pin -dir I -type rst axi_rxs_arstn
create_bd_pin -dir I -type rst axi_txc_arstn
create_bd_pin -dir I -type rst axi_txd_arstn
create_bd_pin -dir I -type clk axis_clk
create_bd_pin -dir I -type clk gtx_clk
create_bd_pin -dir O -type intr interrupt
create_bd_pin -dir O -type intr mac_irq
create_bd_pin -dir O -from 0 -to 0 -type rst phy_rst_n
create_bd_pin -dir I -type clk ref_clk
create_bd_pin -dir I -type clk s_axi_lite_clk
create_bd_pin -dir I -type rst s_axi_lite_resetn
create_bd_pin -dir I -type clk gtx_clk90
create_bd_pin -dir I -type clk refclk
create_bd_pin -dir I AXI_STR_TXD_TVALID
create_bd_pin -dir O AXI_STR_RXD_VALID
create_bd_pin -dir O AXI_STR_TXD_TREADY
create_bd_pin -dir I AXI_STR_RXD_READY
create_bd_pin -dir I AXI_STR_TXD_TLAST
create_bd_pin -dir O AXI_STR_RXD_LAST
create_bd_pin -dir I -from 3 -to 0 AXI_STR_TXD_TKEEP
create_bd_pin -dir O -from 3 -to 0 AXI_STR_RXD_KEEP

create_bd_cell -type module -reference kr260_open_mac mac
create_bd_cell -type ip -vlnv xilinx.com:ip:xlconstant:1.1 one
create_bd_cell -type ip -vlnv xilinx.com:ip:xlconstant:1.1 zero
set_property -dict {CONFIG.CONST_VAL 0} [get_bd_cells zero]
create_bd_cell -type module -reference kr260_open_eth_buffer eth_buf
create_bd_cell -type ip -vlnv xilinx.com:ip:xlconstant:1.1 zero16
set_property -dict {CONFIG.CONST_VAL 0 CONFIG.CONST_WIDTH 16} [get_bd_cells zero16]

# ---- connections ----

current_bd_instance /pl_eth2
connect_bd_intf_net [get_bd_intf_pins m_axis_rxd] [get_bd_intf_pins eth_buf/AXI_STR_RXD]
connect_bd_intf_net [get_bd_intf_pins m_axis_rxs] [get_bd_intf_pins eth_buf/AXI_STR_RXS]
connect_bd_intf_net [get_bd_intf_pins eth_buf/S_AXI_2TEMAC] [get_bd_intf_pins mac/s_axi]
connect_bd_intf_net [get_bd_intf_pins eth_buf/TX_AXIS_MAC] [get_bd_intf_pins mac/tx_axis_mac]
connect_bd_intf_net [get_bd_intf_pins mdio] [get_bd_intf_pins mac/mdio]
connect_bd_intf_net [get_bd_intf_pins rgmii] [get_bd_intf_pins mac/rgmii]
connect_bd_intf_net [get_bd_intf_pins eth_buf/RX_AXIS_MAC] [get_bd_intf_pins mac/rx_axis_mac]
connect_bd_intf_net [get_bd_intf_pins s_axi] [get_bd_intf_pins eth_buf/S_AXI]
connect_bd_intf_net [get_bd_intf_pins s_axis_txc] [get_bd_intf_pins eth_buf/AXI_STR_TXC]
connect_bd_intf_net [get_bd_intf_pins s_axis_txd] [get_bd_intf_pins eth_buf/AXI_STR_TXD]
connect_bd_net [get_bd_pins AXI_STR_RXD_READY] [get_bd_pins eth_buf/AXI_STR_RXD_READY]
connect_bd_net [get_bd_pins AXI_STR_TXD_TKEEP] [get_bd_pins eth_buf/AXI_STR_TXD_TKEEP]
connect_bd_net [get_bd_pins AXI_STR_TXD_TLAST] [get_bd_pins eth_buf/AXI_STR_TXD_TLAST]
connect_bd_net [get_bd_pins AXI_STR_TXD_TVALID] [get_bd_pins eth_buf/AXI_STR_TXD_TVALID]
connect_bd_net [get_bd_pins axi_rxd_arstn] [get_bd_pins eth_buf/AXI_STR_RXD_ARESETN]
connect_bd_net [get_bd_pins axi_rxs_arstn] [get_bd_pins eth_buf/AXI_STR_RXS_ARESETN]
connect_bd_net [get_bd_pins axi_txc_arstn] [get_bd_pins eth_buf/AXI_STR_TXC_ARESETN]
connect_bd_net [get_bd_pins axi_txd_arstn] [get_bd_pins eth_buf/AXI_STR_TXD_ARESETN]
connect_bd_net [get_bd_pins axis_clk] \
  [get_bd_pins eth_buf/AXI_STR_TXD_ACLK] [get_bd_pins eth_buf/AXI_STR_TXC_ACLK] [get_bd_pins eth_buf/AXI_STR_RXD_ACLK] \
  [get_bd_pins eth_buf/AXI_STR_RXS_ACLK]
connect_bd_net [get_bd_pins eth_buf/AXI_STR_RXD_KEEP] [get_bd_pins AXI_STR_RXD_KEEP]
connect_bd_net [get_bd_pins eth_buf/AXI_STR_RXD_LAST] [get_bd_pins AXI_STR_RXD_LAST]
connect_bd_net [get_bd_pins eth_buf/AXI_STR_RXD_VALID] [get_bd_pins AXI_STR_RXD_VALID]
connect_bd_net [get_bd_pins eth_buf/AXI_STR_TXD_TREADY] [get_bd_pins AXI_STR_TXD_TREADY]
connect_bd_net [get_bd_pins eth_buf/INTERRUPT] [get_bd_pins interrupt]
connect_bd_net [get_bd_pins eth_buf/RESET2TEMACn] [get_bd_pins mac/glbl_rstn]
connect_bd_net -net gtx_clk90_1 [get_bd_pins gtx_clk90] [get_bd_pins mac/gtx_clk90]
connect_bd_net [get_bd_pins gtx_clk] [get_bd_pins eth_buf/GTX_CLK] [get_bd_pins mac/gtx_clk]
connect_bd_net [get_bd_pins mac/mac_irq] [get_bd_pins mac_irq]
connect_bd_net [get_bd_pins mac/phy_rst_n] [get_bd_pins phy_rst_n]
connect_bd_net [get_bd_pins mac/rx_enable] [get_bd_pins eth_buf/RX_CLK_ENABLE_IN]
connect_bd_net [get_bd_pins mac/rx_mac_aclk] [get_bd_pins eth_buf/rx_mac_aclk]
connect_bd_net [get_bd_pins mac/rx_reset] [get_bd_pins eth_buf/rx_reset]
connect_bd_net [get_bd_pins mac/rx_statistics_valid] [get_bd_pins eth_buf/rx_statistics_valid]
connect_bd_net [get_bd_pins mac/rx_statistics_vector] [get_bd_pins eth_buf/rx_statistics_vector]
connect_bd_net [get_bd_pins mac/speedis10100] [get_bd_pins eth_buf/speed_is_10_100]
connect_bd_net [get_bd_pins mac/tx_mac_aclk] [get_bd_pins eth_buf/tx_mac_aclk]
connect_bd_net [get_bd_pins mac/tx_reset] [get_bd_pins eth_buf/tx_reset]
connect_bd_net [get_bd_pins one/dout] \
  [get_bd_pins eth_buf/EMAC_RESET_DONE_INT] [get_bd_pins eth_buf/EMAC_RX_DCM_LOCKED_INT] [get_bd_pins eth_buf/mdio_i_top] \
  [get_bd_pins eth_buf/mdio_o_temac] [get_bd_pins eth_buf/mdio_t_temac] [get_bd_pins eth_buf/mdc_temac]
connect_bd_net [get_bd_pins refclk] [get_bd_pins mac/refclk]
connect_bd_net [get_bd_pins s_axi_lite_clk] [get_bd_pins eth_buf/S_AXI_ACLK] [get_bd_pins mac/s_axi_aclk]
connect_bd_net [get_bd_pins s_axi_lite_resetn] [get_bd_pins eth_buf/S_AXI_ARESETN] [get_bd_pins mac/s_axi_resetn]
connect_bd_net [get_bd_pins zero16/dout] [get_bd_pins eth_buf/PCSPMA_STATUS_VECTOR]
connect_bd_net [get_bd_pins zero/dout] \
  [get_bd_pins eth_buf/EMAC_CLIENT_AUTONEG_INT] [get_bd_pins eth_buf/mdio_t_pcspma] [get_bd_pins eth_buf/mdio_o_pcspma]

current_bd_instance /pl_eth3
connect_bd_intf_net [get_bd_intf_pins m_axis_rxd] [get_bd_intf_pins eth_buf/AXI_STR_RXD]
connect_bd_intf_net [get_bd_intf_pins m_axis_rxs] [get_bd_intf_pins eth_buf/AXI_STR_RXS]
connect_bd_intf_net [get_bd_intf_pins eth_buf/S_AXI_2TEMAC] [get_bd_intf_pins mac/s_axi]
connect_bd_intf_net [get_bd_intf_pins eth_buf/TX_AXIS_MAC] [get_bd_intf_pins mac/tx_axis_mac]
connect_bd_intf_net [get_bd_intf_pins mdio] [get_bd_intf_pins mac/mdio]
connect_bd_intf_net [get_bd_intf_pins rgmii] [get_bd_intf_pins mac/rgmii]
connect_bd_intf_net [get_bd_intf_pins eth_buf/RX_AXIS_MAC] [get_bd_intf_pins mac/rx_axis_mac]
connect_bd_intf_net [get_bd_intf_pins s_axi] [get_bd_intf_pins eth_buf/S_AXI]
connect_bd_intf_net [get_bd_intf_pins s_axis_txc] [get_bd_intf_pins eth_buf/AXI_STR_TXC]
connect_bd_intf_net [get_bd_intf_pins s_axis_txd] [get_bd_intf_pins eth_buf/AXI_STR_TXD]
connect_bd_net [get_bd_pins AXI_STR_RXD_READY] [get_bd_pins eth_buf/AXI_STR_RXD_READY]
connect_bd_net [get_bd_pins AXI_STR_TXD_TKEEP] [get_bd_pins eth_buf/AXI_STR_TXD_TKEEP]
connect_bd_net [get_bd_pins AXI_STR_TXD_TLAST] [get_bd_pins eth_buf/AXI_STR_TXD_TLAST]
connect_bd_net [get_bd_pins AXI_STR_TXD_TVALID] [get_bd_pins eth_buf/AXI_STR_TXD_TVALID]
connect_bd_net [get_bd_pins axi_rxd_arstn] [get_bd_pins eth_buf/AXI_STR_RXD_ARESETN]
connect_bd_net [get_bd_pins axi_rxs_arstn] [get_bd_pins eth_buf/AXI_STR_RXS_ARESETN]
connect_bd_net [get_bd_pins axi_txc_arstn] [get_bd_pins eth_buf/AXI_STR_TXC_ARESETN]
connect_bd_net [get_bd_pins axi_txd_arstn] [get_bd_pins eth_buf/AXI_STR_TXD_ARESETN]
connect_bd_net [get_bd_pins axis_clk] \
  [get_bd_pins eth_buf/AXI_STR_TXD_ACLK] [get_bd_pins eth_buf/AXI_STR_TXC_ACLK] [get_bd_pins eth_buf/AXI_STR_RXD_ACLK] \
  [get_bd_pins eth_buf/AXI_STR_RXS_ACLK]
connect_bd_net [get_bd_pins eth_buf/AXI_STR_RXD_KEEP] [get_bd_pins AXI_STR_RXD_KEEP]
connect_bd_net [get_bd_pins eth_buf/AXI_STR_RXD_LAST] [get_bd_pins AXI_STR_RXD_LAST]
connect_bd_net [get_bd_pins eth_buf/AXI_STR_RXD_VALID] [get_bd_pins AXI_STR_RXD_VALID]
connect_bd_net [get_bd_pins eth_buf/AXI_STR_TXD_TREADY] [get_bd_pins AXI_STR_TXD_TREADY]
connect_bd_net [get_bd_pins eth_buf/INTERRUPT] [get_bd_pins interrupt]
connect_bd_net [get_bd_pins eth_buf/RESET2TEMACn] [get_bd_pins mac/glbl_rstn]
connect_bd_net -net gtx_clk90_1 [get_bd_pins gtx_clk90] [get_bd_pins mac/gtx_clk90]
connect_bd_net [get_bd_pins gtx_clk] [get_bd_pins eth_buf/GTX_CLK] [get_bd_pins mac/gtx_clk]
connect_bd_net [get_bd_pins mac/mac_irq] [get_bd_pins mac_irq]
connect_bd_net [get_bd_pins mac/phy_rst_n] [get_bd_pins phy_rst_n]
connect_bd_net [get_bd_pins mac/rx_enable] [get_bd_pins eth_buf/RX_CLK_ENABLE_IN]
connect_bd_net [get_bd_pins mac/rx_mac_aclk] [get_bd_pins eth_buf/rx_mac_aclk]
connect_bd_net [get_bd_pins mac/rx_reset] [get_bd_pins eth_buf/rx_reset]
connect_bd_net [get_bd_pins mac/rx_statistics_valid] [get_bd_pins eth_buf/rx_statistics_valid]
connect_bd_net [get_bd_pins mac/rx_statistics_vector] [get_bd_pins eth_buf/rx_statistics_vector]
connect_bd_net [get_bd_pins mac/speedis10100] [get_bd_pins eth_buf/speed_is_10_100]
connect_bd_net [get_bd_pins mac/tx_mac_aclk] [get_bd_pins eth_buf/tx_mac_aclk]
connect_bd_net [get_bd_pins mac/tx_reset] [get_bd_pins eth_buf/tx_reset]
connect_bd_net [get_bd_pins one/dout] \
  [get_bd_pins eth_buf/EMAC_RESET_DONE_INT] [get_bd_pins eth_buf/EMAC_RX_DCM_LOCKED_INT] [get_bd_pins eth_buf/mdio_i_top] \
  [get_bd_pins eth_buf/mdio_o_temac] [get_bd_pins eth_buf/mdio_t_temac] [get_bd_pins eth_buf/mdc_temac]
connect_bd_net [get_bd_pins refclk] [get_bd_pins mac/refclk]
connect_bd_net [get_bd_pins s_axi_lite_clk] [get_bd_pins eth_buf/S_AXI_ACLK] [get_bd_pins mac/s_axi_aclk]
connect_bd_net [get_bd_pins s_axi_lite_resetn] [get_bd_pins eth_buf/S_AXI_ARESETN] [get_bd_pins mac/s_axi_resetn]
connect_bd_net [get_bd_pins zero16/dout] [get_bd_pins eth_buf/PCSPMA_STATUS_VECTOR]
connect_bd_net [get_bd_pins zero/dout] \
  [get_bd_pins eth_buf/EMAC_CLIENT_AUTONEG_INT] [get_bd_pins eth_buf/mdio_t_pcspma] [get_bd_pins eth_buf/mdio_o_pcspma]

current_bd_instance /
connect_bd_intf_net [get_bd_intf_pins axi_interconnect_0/M00_AXI] [get_bd_intf_pins vcu_0/S_AXI_LITE]
connect_bd_intf_net [get_bd_intf_pins axi_interconnect_0/M01_AXI] [get_bd_intf_pins pl_eth2/s_axi]
connect_bd_intf_net [get_bd_intf_pins axi_interconnect_0/M02_AXI] [get_bd_intf_pins eth_dma2/S_AXI_LITE]
connect_bd_intf_net [get_bd_intf_pins axi_interconnect_0/M03_AXI] [get_bd_intf_pins pl_eth3/s_axi]
connect_bd_intf_net [get_bd_intf_pins axi_interconnect_0/M04_AXI] [get_bd_intf_pins eth_dma3/S_AXI_LITE]
connect_bd_intf_net [get_bd_intf_pins axi_interconnect_0/M05_AXI] [get_bd_intf_pins can_apb/AXI4_LITE]
connect_bd_intf_net [get_bd_intf_pins axi_interconnect_0/M06_AXI] [get_bd_intf_pins axi_gpio_j18/S_AXI]
connect_bd_intf_net [get_bd_intf_pins axi_interconnect_0/M07_AXI] [get_bd_intf_pins xvc_bridge/S_AXI]
connect_bd_intf_net [get_bd_intf_pins axi_interconnect_0/M08_AXI] [get_bd_intf_pins eth_recovery_regs/S_AXI]
connect_bd_intf_net [get_bd_intf_pins axi_interconnect_0/M09_AXI] [get_bd_intf_pins eth_recovery_policy/S_AXI]
connect_bd_intf_net [get_bd_intf_pins axi_interconnect_0/M10_AXI] [get_bd_intf_pins pl_shadow_0/S_AXI]
connect_bd_intf_net [get_bd_intf_pins axi_interconnect_0/M11_AXI] [get_bd_intf_pins can_path0/S_AXI]
connect_bd_intf_net [get_bd_intf_pins axi_interconnect_0/M12_AXI] [get_bd_intf_pins can_path1/S_AXI]
connect_bd_intf_net [get_bd_intf_pins can_apb/APB_M] [get_bd_intf_pins ctu_can2/s_apb]
connect_bd_intf_net [get_bd_intf_pins eth_dma2/M_AXIS_CNTRL] [get_bd_intf_pins pl_eth2/s_axis_txc]
connect_bd_intf_net [get_bd_intf_pins eth_dma2/M_AXIS_MM2S] [get_bd_intf_pins pl_eth2/s_axis_txd]
connect_bd_intf_net [get_bd_intf_pins eth_dma2/M_AXI_MM2S] [get_bd_intf_pins eth_memory/S00_AXI]
connect_bd_intf_net [get_bd_intf_pins eth_dma2/M_AXI_S2MM] [get_bd_intf_pins eth_memory/S01_AXI]
connect_bd_intf_net [get_bd_intf_pins eth_dma2/M_AXI_SG] [get_bd_intf_pins eth_memory/S02_AXI]
connect_bd_intf_net [get_bd_intf_pins eth_dma3/M_AXIS_CNTRL] [get_bd_intf_pins pl_eth3/s_axis_txc]
connect_bd_intf_net [get_bd_intf_pins eth_dma3/M_AXIS_MM2S] [get_bd_intf_pins pl_eth3/s_axis_txd]
connect_bd_intf_net [get_bd_intf_pins eth_dma3/M_AXI_MM2S] [get_bd_intf_pins eth_memory/S03_AXI]
connect_bd_intf_net [get_bd_intf_pins eth_dma3/M_AXI_S2MM] [get_bd_intf_pins eth_memory/S04_AXI]
connect_bd_intf_net [get_bd_intf_pins eth_dma3/M_AXI_SG] [get_bd_intf_pins eth_memory/S05_AXI]
connect_bd_intf_net [get_bd_intf_pins eth_memory/M00_AXI] [get_bd_intf_pins zynq_ultra_ps_e_0/S_AXI_HPC1_FPD]
connect_bd_intf_net [get_bd_intf_pins eth_dma2/S_AXIS_S2MM] [get_bd_intf_pins pl_eth2/m_axis_rxd]
connect_bd_intf_net [get_bd_intf_pins eth_dma2/S_AXIS_STS] [get_bd_intf_pins pl_eth2/m_axis_rxs]
connect_bd_intf_net [get_bd_intf_ports eth2_mdio] [get_bd_intf_pins pl_eth2/mdio]
connect_bd_intf_net [get_bd_intf_ports eth2_rgmii] [get_bd_intf_pins pl_eth2/rgmii]
connect_bd_intf_net [get_bd_intf_pins eth_dma3/S_AXIS_S2MM] [get_bd_intf_pins pl_eth3/m_axis_rxd]
connect_bd_intf_net [get_bd_intf_pins eth_dma3/S_AXIS_STS] [get_bd_intf_pins pl_eth3/m_axis_rxs]
connect_bd_intf_net [get_bd_intf_ports eth3_mdio] [get_bd_intf_pins pl_eth3/mdio]
connect_bd_intf_net [get_bd_intf_ports eth3_rgmii] [get_bd_intf_pins pl_eth3/rgmii]
connect_bd_intf_net [get_bd_intf_pins vcu_0/M_AXI_DEC0] [get_bd_intf_pins zynq_ultra_ps_e_0/S_AXI_HP2_FPD]
connect_bd_intf_net [get_bd_intf_pins vcu_0/M_AXI_DEC1] [get_bd_intf_pins zynq_ultra_ps_e_0/S_AXI_HP3_FPD]
connect_bd_intf_net [get_bd_intf_pins vcu_0/M_AXI_ENC0] [get_bd_intf_pins zynq_ultra_ps_e_0/S_AXI_HP0_FPD]
connect_bd_intf_net [get_bd_intf_pins vcu_0/M_AXI_ENC1] [get_bd_intf_pins zynq_ultra_ps_e_0/S_AXI_HP1_FPD]
connect_bd_intf_net [get_bd_intf_pins vcu_0/M_AXI_MCU] [get_bd_intf_pins zynq_ultra_ps_e_0/S_AXI_HPC0_FPD]
connect_bd_intf_net [get_bd_intf_pins xvc_bridge/m0_bscan] [get_bd_intf_pins xvc_hub/S_BSCAN]
connect_bd_intf_net [get_bd_intf_pins zynq_ultra_ps_e_0/M_AXI_HPM0_LPD] [get_bd_intf_pins axi_interconnect_0/S00_AXI]
connect_bd_net [get_bd_ports gpio_j18_tri_i] [get_bd_pins axi_gpio_j18/gpio_io_i] [get_bd_pins can_io_observer_0/gpio_i_raw]
connect_bd_net [get_bd_pins pl_eth2/AXI_STR_RXD_VALID] [get_bd_pins eth_dma2/s_axis_s2mm_tvalid] [get_bd_pins pl_shadow_0/rx2_valid]
connect_bd_net [get_bd_pins pl_eth2/AXI_STR_TXD_TREADY] [get_bd_pins eth_dma2/m_axis_mm2s_tready] [get_bd_pins pl_shadow_0/tx2_ready]
connect_bd_net [get_bd_pins pl_eth2/AXI_STR_RXD_LAST] [get_bd_pins eth_dma2/s_axis_s2mm_tlast] [get_bd_pins pl_shadow_0/rx2_last]
connect_bd_net [get_bd_pins pl_eth2/AXI_STR_RXD_KEEP] [get_bd_pins eth_dma2/s_axis_s2mm_tkeep] [get_bd_pins pl_shadow_0/rx2_keep]
connect_bd_net [get_bd_pins pl_eth3/AXI_STR_RXD_VALID] [get_bd_pins eth_dma3/s_axis_s2mm_tvalid] [get_bd_pins pl_shadow_0/rx3_valid]
connect_bd_net [get_bd_pins pl_eth3/AXI_STR_TXD_TREADY] [get_bd_pins eth_dma3/m_axis_mm2s_tready] [get_bd_pins pl_shadow_0/tx3_ready]
connect_bd_net [get_bd_pins pl_eth3/AXI_STR_RXD_LAST] [get_bd_pins eth_dma3/s_axis_s2mm_tlast] [get_bd_pins pl_shadow_0/rx3_last]
connect_bd_net [get_bd_pins pl_eth3/AXI_STR_RXD_KEEP] [get_bd_pins eth_dma3/s_axis_s2mm_tkeep] [get_bd_pins pl_shadow_0/rx3_keep]
connect_bd_net [get_bd_pins axi_gpio_j18/gpio_io_o] [get_bd_pins can_io_observer_0/gpio_o_raw] [get_bd_ports gpio_j18_tri_o]
connect_bd_net [get_bd_pins axi_gpio_j18/gpio_io_t] [get_bd_pins can_io_observer_0/gpio_t_raw] [get_bd_ports gpio_j18_tri_t]
connect_bd_net [get_bd_pins axi_gpio_j18/ip2intc_irpt] [get_bd_pins system_irqs/In2]
connect_bd_net [get_bd_ports can0_rx] \
  [get_bd_pins can_io_observer_0/can0_rx_raw] [get_bd_pins pl_shadow_0/can0_rx_raw] [get_bd_pins can_path0/can_rx_raw]
connect_bd_net [get_bd_ports can1_rx] \
  [get_bd_pins can_io_observer_0/can1_rx_raw] [get_bd_pins pl_shadow_0/can1_rx_raw] [get_bd_pins can_path1/can_rx_raw]
connect_bd_net [get_bd_ports can2_rx] [get_bd_pins ctu_can2/CAN_rx] [get_bd_pins can_io_observer_0/can2_rx_raw]
connect_bd_net [get_bd_pins can_io_observer_0/can_observed] [get_bd_pins ila_can_io/probe0]
connect_bd_net [get_bd_pins can_io_observer_0/gpio_i_observed] [get_bd_pins ila_can_io/probe1]
connect_bd_net [get_bd_pins can_io_observer_0/gpio_o_observed] [get_bd_pins ila_can_io/probe2]
connect_bd_net [get_bd_pins can_io_observer_0/gpio_t_observed] [get_bd_pins ila_can_io/probe3]
connect_bd_net [get_bd_pins can_io_observer_0/resetn_observed] [get_bd_pins ila_can_io/probe4]
connect_bd_net [get_bd_pins can_io_observer_0/sample_tick] [get_bd_pins ila_can_io/probe5]
connect_bd_net [get_bd_pins can_io_observer_0/timestamp] [get_bd_pins ila_can_io/probe6]
connect_bd_net [get_bd_pins can_path0/apb_addr] [get_bd_pins pl_can_core0/s_apb_paddr]
connect_bd_net [get_bd_pins can_path0/apb_enable] [get_bd_pins pl_can_core0/s_apb_penable]
connect_bd_net [get_bd_pins can_path0/apb_prot] [get_bd_pins pl_can_core0/s_apb_pprot]
connect_bd_net [get_bd_pins can_path0/apb_sel] [get_bd_pins pl_can_core0/s_apb_psel]
connect_bd_net [get_bd_pins can_path0/apb_strb] [get_bd_pins pl_can_core0/s_apb_pstrb]
connect_bd_net [get_bd_pins can_path0/apb_wdata] [get_bd_pins pl_can_core0/s_apb_pwdata]
connect_bd_net [get_bd_pins can_path0/apb_write] [get_bd_pins pl_can_core0/s_apb_pwrite]
connect_bd_net [get_bd_pins can_path0/core_resetn] [get_bd_pins pl_can_core0/arstn]
connect_bd_net [get_bd_pins can_path0/debug_bus] [get_bd_pins ila_can_lifecycle0/probe0]
connect_bd_net [get_bd_pins can_path0/irq_control] [get_bd_pins system_irqs/In4]
connect_bd_net [get_bd_pins can_path0/irq_native] [get_bd_pins system_irqs/In3]
connect_bd_net [get_bd_pins can_path0/pl_rx] [get_bd_pins pl_can_core0/CAN_rx]
connect_bd_net [get_bd_pins can_path0/ps_rx] [get_bd_pins zynq_ultra_ps_e_0/emio_can0_phy_rx]
connect_bd_net [get_bd_pins can_path0/timestamp] [get_bd_pins pl_can_core0/timestamp]
connect_bd_net [get_bd_pins can_path1/apb_addr] [get_bd_pins pl_can_core1/s_apb_paddr]
connect_bd_net [get_bd_pins can_path1/apb_enable] [get_bd_pins pl_can_core1/s_apb_penable]
connect_bd_net [get_bd_pins can_path1/apb_prot] [get_bd_pins pl_can_core1/s_apb_pprot]
connect_bd_net [get_bd_pins can_path1/apb_sel] [get_bd_pins pl_can_core1/s_apb_psel]
connect_bd_net [get_bd_pins can_path1/apb_strb] [get_bd_pins pl_can_core1/s_apb_pstrb]
connect_bd_net [get_bd_pins can_path1/apb_wdata] [get_bd_pins pl_can_core1/s_apb_pwdata]
connect_bd_net [get_bd_pins can_path1/apb_write] [get_bd_pins pl_can_core1/s_apb_pwrite]
connect_bd_net [get_bd_pins can_path1/core_resetn] [get_bd_pins pl_can_core1/arstn]
connect_bd_net [get_bd_pins can_path1/debug_bus] [get_bd_pins ila_can_lifecycle1/probe0]
connect_bd_net [get_bd_pins can_path1/irq_control] [get_bd_pins system_irqs/In6]
connect_bd_net [get_bd_pins can_path1/irq_native] [get_bd_pins system_irqs/In5]
connect_bd_net [get_bd_pins can_path1/pl_rx] [get_bd_pins pl_can_core1/CAN_rx]
connect_bd_net [get_bd_pins can_path1/ps_rx] [get_bd_pins zynq_ultra_ps_e_0/emio_can1_phy_rx]
connect_bd_net [get_bd_pins can_path1/timestamp] [get_bd_pins pl_can_core1/timestamp]
connect_bd_net [get_bd_pins can_reset/peripheral_aresetn] \
  [get_bd_pins can_apb/s_axi_aresetn] [get_bd_pins ctu_can2/arstn] [get_bd_pins axi_interconnect_0/M05_ARESETN] \
  [get_bd_pins can_io_observer_0/can2_resetn_raw]
connect_bd_net [get_bd_pins can_reset/peripheral_reset] [get_bd_pins can_timestamp/SCLR]
connect_bd_net [get_bd_pins can_timestamp/Q] [get_bd_pins ctu_can2/timestamp]
connect_bd_net [get_bd_pins clk_wiz_0/clk_out1] [get_bd_pins vcu_0/pll_ref_clk]
connect_bd_net [get_bd_pins clk_wiz_0/locked] [get_bd_pins proc_sys_reset_0/dcm_locked]
connect_bd_net [get_bd_pins dbg_zero1/dout] \
  [get_bd_pins ila_eth3/probe2] [get_bd_pins ila_eth3/probe3] [get_bd_pins ila_eth3/probe4] [get_bd_pins ila_eth3/probe6] \
  [get_bd_pins ila_eth3/probe7] [get_bd_pins ila_eth3/probe8] [get_bd_pins ila_eth3/probe10] [get_bd_pins ila_eth3/probe11] \
  [get_bd_pins ila_eth3/probe12] [get_bd_pins ila_eth3/probe13] [get_bd_pins ila_eth3/probe14] [get_bd_pins ila_eth3/probe15] \
  [get_bd_pins ila_eth3/probe16] [get_bd_pins ila_eth3/probe17] [get_bd_pins ila_eth3/probe18]
connect_bd_net [get_bd_pins dbg_zero32/dout] [get_bd_pins ila_eth3/probe0] [get_bd_pins ila_eth3/probe5]
connect_bd_net [get_bd_pins dbg_zero4/dout] [get_bd_pins ila_eth3/probe1]
connect_bd_net [get_bd_pins dbg_zero8/dout] [get_bd_pins ila_eth3/probe9]
connect_bd_net [get_bd_pins eth2_recovery_reset/peripheral_aresetn] [get_bd_pins eth_dma2/axi_resetn] [get_bd_pins pl_eth2/s_axi_lite_resetn]
connect_bd_net [get_bd_pins eth3_recovery_reset/peripheral_aresetn] [get_bd_pins eth_dma3/axi_resetn] [get_bd_pins pl_eth3/s_axi_lite_resetn]
connect_bd_net [get_bd_pins eth_clock/clk_out1] \
  [get_bd_pins eth_dma2/m_axi_mm2s_aclk] [get_bd_pins eth_dma2/m_axi_s2mm_aclk] [get_bd_pins eth_dma2/m_axi_sg_aclk] \
  [get_bd_pins eth_dma3/m_axi_mm2s_aclk] [get_bd_pins eth_dma3/m_axi_s2mm_aclk] [get_bd_pins eth_dma3/m_axi_sg_aclk] \
  [get_bd_pins eth_memory/aclk] [get_bd_pins zynq_ultra_ps_e_0/saxihpc1_fpd_aclk] [get_bd_pins eth_reset/slowest_sync_clk] \
  [get_bd_pins xvc_hub/clk] [get_bd_pins ila_eth3/clk] [get_bd_pins pl_eth2/axis_clk] [get_bd_pins pl_eth2/gtx_clk] \
  [get_bd_pins pl_eth3/axis_clk] [get_bd_pins pl_eth3/gtx_clk] [get_bd_pins pl_shadow_0/eth_clk]
connect_bd_net [get_bd_pins eth_clock/clk_out2] \
  [get_bd_pins pl_eth2/ref_clk] [get_bd_pins pl_eth3/ref_clk] [get_bd_pins pl_eth2/refclk] [get_bd_pins pl_eth3/refclk]
connect_bd_net [get_bd_pins eth_clock/clk_out3] \
  [get_bd_pins can_apb/s_axi_aclk] [get_bd_pins ctu_can2/aclk] [get_bd_pins can_reset/slowest_sync_clk] \
  [get_bd_pins axi_interconnect_0/M05_ACLK] [get_bd_pins can_timestamp/CLK]
connect_bd_net [get_bd_pins eth_clock/clk_out4] [get_bd_pins pl_eth2/gtx_clk90] [get_bd_pins pl_eth3/gtx_clk90]
connect_bd_net [get_bd_pins eth_clock/locked] \
  [get_bd_pins eth_reset/dcm_locked] [get_bd_pins can_reset/dcm_locked] [get_bd_pins eth2_recovery_reset/dcm_locked] \
  [get_bd_pins eth3_recovery_reset/dcm_locked]
connect_bd_net [get_bd_pins eth_dma2/m_axis_mm2s_tkeep] [get_bd_pins pl_eth2/AXI_STR_TXD_TKEEP] [get_bd_pins pl_shadow_0/tx2_keep]
connect_bd_net [get_bd_pins eth_dma2/m_axis_mm2s_tlast] [get_bd_pins pl_eth2/AXI_STR_TXD_TLAST] [get_bd_pins pl_shadow_0/tx2_last]
connect_bd_net [get_bd_pins eth_dma2/m_axis_mm2s_tvalid] [get_bd_pins pl_eth2/AXI_STR_TXD_TVALID] [get_bd_pins pl_shadow_0/tx2_valid]
connect_bd_net [get_bd_pins eth_dma2/mm2s_cntrl_reset_out_n] [get_bd_pins pl_eth2/axi_txc_arstn]
connect_bd_net [get_bd_pins eth_dma2/mm2s_introut] [get_bd_pins eth_irqs/In6]
connect_bd_net [get_bd_pins eth_dma2/mm2s_prmry_reset_out_n] [get_bd_pins pl_eth2/axi_txd_arstn]
connect_bd_net [get_bd_pins eth_dma2/s2mm_introut] [get_bd_pins eth_irqs/In7]
connect_bd_net [get_bd_pins eth_dma2/s2mm_prmry_reset_out_n] [get_bd_pins pl_eth2/axi_rxd_arstn]
connect_bd_net [get_bd_pins eth_dma2/s2mm_sts_reset_out_n] [get_bd_pins pl_eth2/axi_rxs_arstn]
connect_bd_net [get_bd_pins eth_dma2/s_axis_s2mm_tready] [get_bd_pins pl_eth2/AXI_STR_RXD_READY] [get_bd_pins pl_shadow_0/rx2_ready]
connect_bd_net [get_bd_pins eth_dma3/m_axis_mm2s_tkeep] [get_bd_pins pl_eth3/AXI_STR_TXD_TKEEP] [get_bd_pins pl_shadow_0/tx3_keep]
connect_bd_net [get_bd_pins eth_dma3/m_axis_mm2s_tlast] [get_bd_pins pl_eth3/AXI_STR_TXD_TLAST] [get_bd_pins pl_shadow_0/tx3_last]
connect_bd_net [get_bd_pins eth_dma3/m_axis_mm2s_tvalid] [get_bd_pins pl_eth3/AXI_STR_TXD_TVALID] [get_bd_pins pl_shadow_0/tx3_valid]
connect_bd_net [get_bd_pins eth_dma3/mm2s_cntrl_reset_out_n] [get_bd_pins pl_eth3/axi_txc_arstn]
connect_bd_net [get_bd_pins eth_dma3/mm2s_introut] [get_bd_pins eth_irqs/In2]
connect_bd_net [get_bd_pins eth_dma3/mm2s_prmry_reset_out_n] [get_bd_pins pl_eth3/axi_txd_arstn]
connect_bd_net [get_bd_pins eth_dma3/s2mm_introut] [get_bd_pins eth_irqs/In3]
connect_bd_net [get_bd_pins eth_dma3/s2mm_prmry_reset_out_n] [get_bd_pins pl_eth3/axi_rxd_arstn]
connect_bd_net [get_bd_pins eth_dma3/s2mm_sts_reset_out_n] [get_bd_pins pl_eth3/axi_rxs_arstn]
connect_bd_net [get_bd_pins eth_dma3/s_axis_s2mm_tready] [get_bd_pins pl_eth3/AXI_STR_RXD_READY] [get_bd_pins pl_shadow_0/rx3_ready]
connect_bd_net [get_bd_pins eth_irqs/dout] [get_bd_pins zynq_ultra_ps_e_0/pl_ps_irq1]
connect_bd_net [get_bd_pins eth_recovery/detail_word] [get_bd_pins eth_recovery_policy/gpio2_io_i]
connect_bd_net [get_bd_pins eth_recovery/phy2_n] [get_bd_ports eth2_resetn]
connect_bd_net [get_bd_pins eth_recovery/phy3_n] [get_bd_ports eth3_resetn]
connect_bd_net [get_bd_pins eth_recovery_policy/gpio_io_o] [get_bd_pins eth_recovery/policy_word]
connect_bd_net [get_bd_pins eth_recovery/port2_resetn] [get_bd_pins eth2_recovery_reset/ext_reset_in]
connect_bd_net [get_bd_pins eth_recovery/port3_resetn] [get_bd_pins eth3_recovery_reset/ext_reset_in]
connect_bd_net [get_bd_pins eth_recovery_regs/gpio_io_o] [get_bd_pins eth_recovery/command_word]
connect_bd_net [get_bd_pins eth_recovery/status_word] [get_bd_pins eth_recovery_regs/gpio2_io_i]
connect_bd_net -net eth_refclk_25_1 [get_bd_ports eth_refclk_25] [get_bd_pins eth_clock/clk_in1]
connect_bd_net [get_bd_pins eth_reset/interconnect_aresetn] [get_bd_pins eth_memory/aresetn]
connect_bd_net -net pl_can2_can_phy_tx [get_bd_pins ctu_can2/CAN_tx] [get_bd_ports can2_tx] [get_bd_pins can_io_observer_0/can2_tx_raw]
connect_bd_net -net pl_can2_ip2bus_intrevent [get_bd_pins ctu_can2/irq] [get_bd_pins system_irqs/In1]
connect_bd_net [get_bd_pins pl_can_core0/CAN_tx] [get_bd_pins can_path0/pl_tx]
connect_bd_net [get_bd_pins pl_can_core0/irq] [get_bd_pins can_path0/core_irq]
connect_bd_net [get_bd_pins pl_can_core0/s_apb_prdata] [get_bd_pins can_path0/apb_rdata]
connect_bd_net [get_bd_pins pl_can_core0/s_apb_pready] [get_bd_pins can_path0/apb_ready]
connect_bd_net [get_bd_pins pl_can_core0/s_apb_pslverr] [get_bd_pins can_path0/apb_error]
connect_bd_net [get_bd_pins pl_can_core1/CAN_tx] [get_bd_pins can_path1/pl_tx]
connect_bd_net [get_bd_pins pl_can_core1/irq] [get_bd_pins can_path1/core_irq]
connect_bd_net [get_bd_pins pl_can_core1/s_apb_prdata] [get_bd_pins can_path1/apb_rdata]
connect_bd_net [get_bd_pins pl_can_core1/s_apb_pready] [get_bd_pins can_path1/apb_ready]
connect_bd_net [get_bd_pins pl_can_core1/s_apb_pslverr] [get_bd_pins can_path1/apb_error]
connect_bd_net [get_bd_pins pl_eth2/interrupt] [get_bd_pins eth_irqs/In5]
connect_bd_net [get_bd_pins pl_eth2/mac_irq] [get_bd_pins eth_irqs/In4]
connect_bd_net [get_bd_pins pl_eth2/phy_rst_n] [get_bd_pins eth_recovery/phy2_raw_n]
connect_bd_net [get_bd_pins pl_eth3/interrupt] [get_bd_pins eth_irqs/In1]
connect_bd_net [get_bd_pins pl_eth3/mac_irq] [get_bd_pins eth_irqs/In0]
connect_bd_net [get_bd_pins pl_eth3/phy_rst_n] [get_bd_pins eth_recovery/phy3_raw_n]
connect_bd_net [get_bd_pins proc_sys_reset_0/interconnect_aresetn] \
  [get_bd_pins axi_interconnect_0/ARESETN] [get_bd_pins axi_interconnect_0/S00_ARESETN] \
  [get_bd_pins axi_interconnect_0/M00_ARESETN] [get_bd_pins axi_interconnect_0/M01_ARESETN] \
  [get_bd_pins axi_interconnect_0/M02_ARESETN] [get_bd_pins axi_interconnect_0/M03_ARESETN] \
  [get_bd_pins axi_interconnect_0/M04_ARESETN] [get_bd_pins axi_interconnect_0/M06_ARESETN]
connect_bd_net [get_bd_pins proc_sys_reset_0/peripheral_aresetn] \
  [get_bd_pins vcu_0/vcu_resetn] [get_bd_pins axi_gpio_j18/s_axi_aresetn] [get_bd_pins xvc_bridge/s_axi_aresetn] \
  [get_bd_pins axi_interconnect_0/M07_ARESETN] [get_bd_pins eth_recovery_regs/s_axi_aresetn] \
  [get_bd_pins axi_interconnect_0/M08_ARESETN] [get_bd_pins axi_interconnect_0/M09_ARESETN] \
  [get_bd_pins eth_recovery_policy/s_axi_aresetn] [get_bd_pins can_io_observer_0/gpio_resetn_raw] \
  [get_bd_pins eth_recovery/resetn] [get_bd_pins axi_interconnect_0/M10_ARESETN] [get_bd_pins pl_shadow_0/s_axi_aresetn] \
  [get_bd_pins axi_interconnect_0/M11_ARESETN] [get_bd_pins axi_interconnect_0/M12_ARESETN] \
  [get_bd_pins can_path0/s_axi_aresetn] [get_bd_pins can_path1/s_axi_aresetn]
connect_bd_net [get_bd_pins system_irqs/dout] [get_bd_pins zynq_ultra_ps_e_0/pl_ps_irq0]
connect_bd_net [get_bd_pins vcu_0/vcu_host_interrupt] [get_bd_pins system_irqs/In0]
connect_bd_net [get_bd_pins xlconstant_0/dout] \
  [get_bd_pins proc_sys_reset_0/aux_reset_in] [get_bd_pins proc_sys_reset_0/mb_debug_sys_rst] \
  [get_bd_pins eth_reset/aux_reset_in] [get_bd_pins eth_reset/mb_debug_sys_rst] [get_bd_pins can_reset/aux_reset_in] \
  [get_bd_pins can_reset/mb_debug_sys_rst] [get_bd_pins eth2_recovery_reset/aux_reset_in] \
  [get_bd_pins eth2_recovery_reset/mb_debug_sys_rst] [get_bd_pins eth3_recovery_reset/aux_reset_in] \
  [get_bd_pins eth3_recovery_reset/mb_debug_sys_rst]
connect_bd_net -net zynq_ultra_ps_e_0_emio_can0_phy_tx [get_bd_pins can_path0/can_tx] \
  [get_bd_ports can0_tx] [get_bd_pins can_io_observer_0/can0_tx_raw] [get_bd_pins pl_shadow_0/can0_tx_raw]
connect_bd_net [get_bd_pins zynq_ultra_ps_e_0/emio_can0_phy_tx] [get_bd_pins can_path0/ps_tx]
connect_bd_net -net zynq_ultra_ps_e_0_emio_can1_phy_tx [get_bd_pins can_path1/can_tx] \
  [get_bd_ports can1_tx] [get_bd_pins can_io_observer_0/can1_tx_raw] [get_bd_pins pl_shadow_0/can1_tx_raw]
